# EasyEDA Pro project 差分采样.epro

# Schematic Schematic2
Board Name: 电流; Create Date: 2025-08-14; Page Name: P1; Project Name: 差分采样; Schematic Name: Schematic2; Update Date: 2025-08-14; BladeWidth: 10; Company: 嘉立创EDA; Page Size: A4; RegionStart: 1; ShowBorder: 1; TitleBlock: 1; TitleBlockPosition: 3; Version: V1.0; XRegionCount: 6; YRegionCount: 4
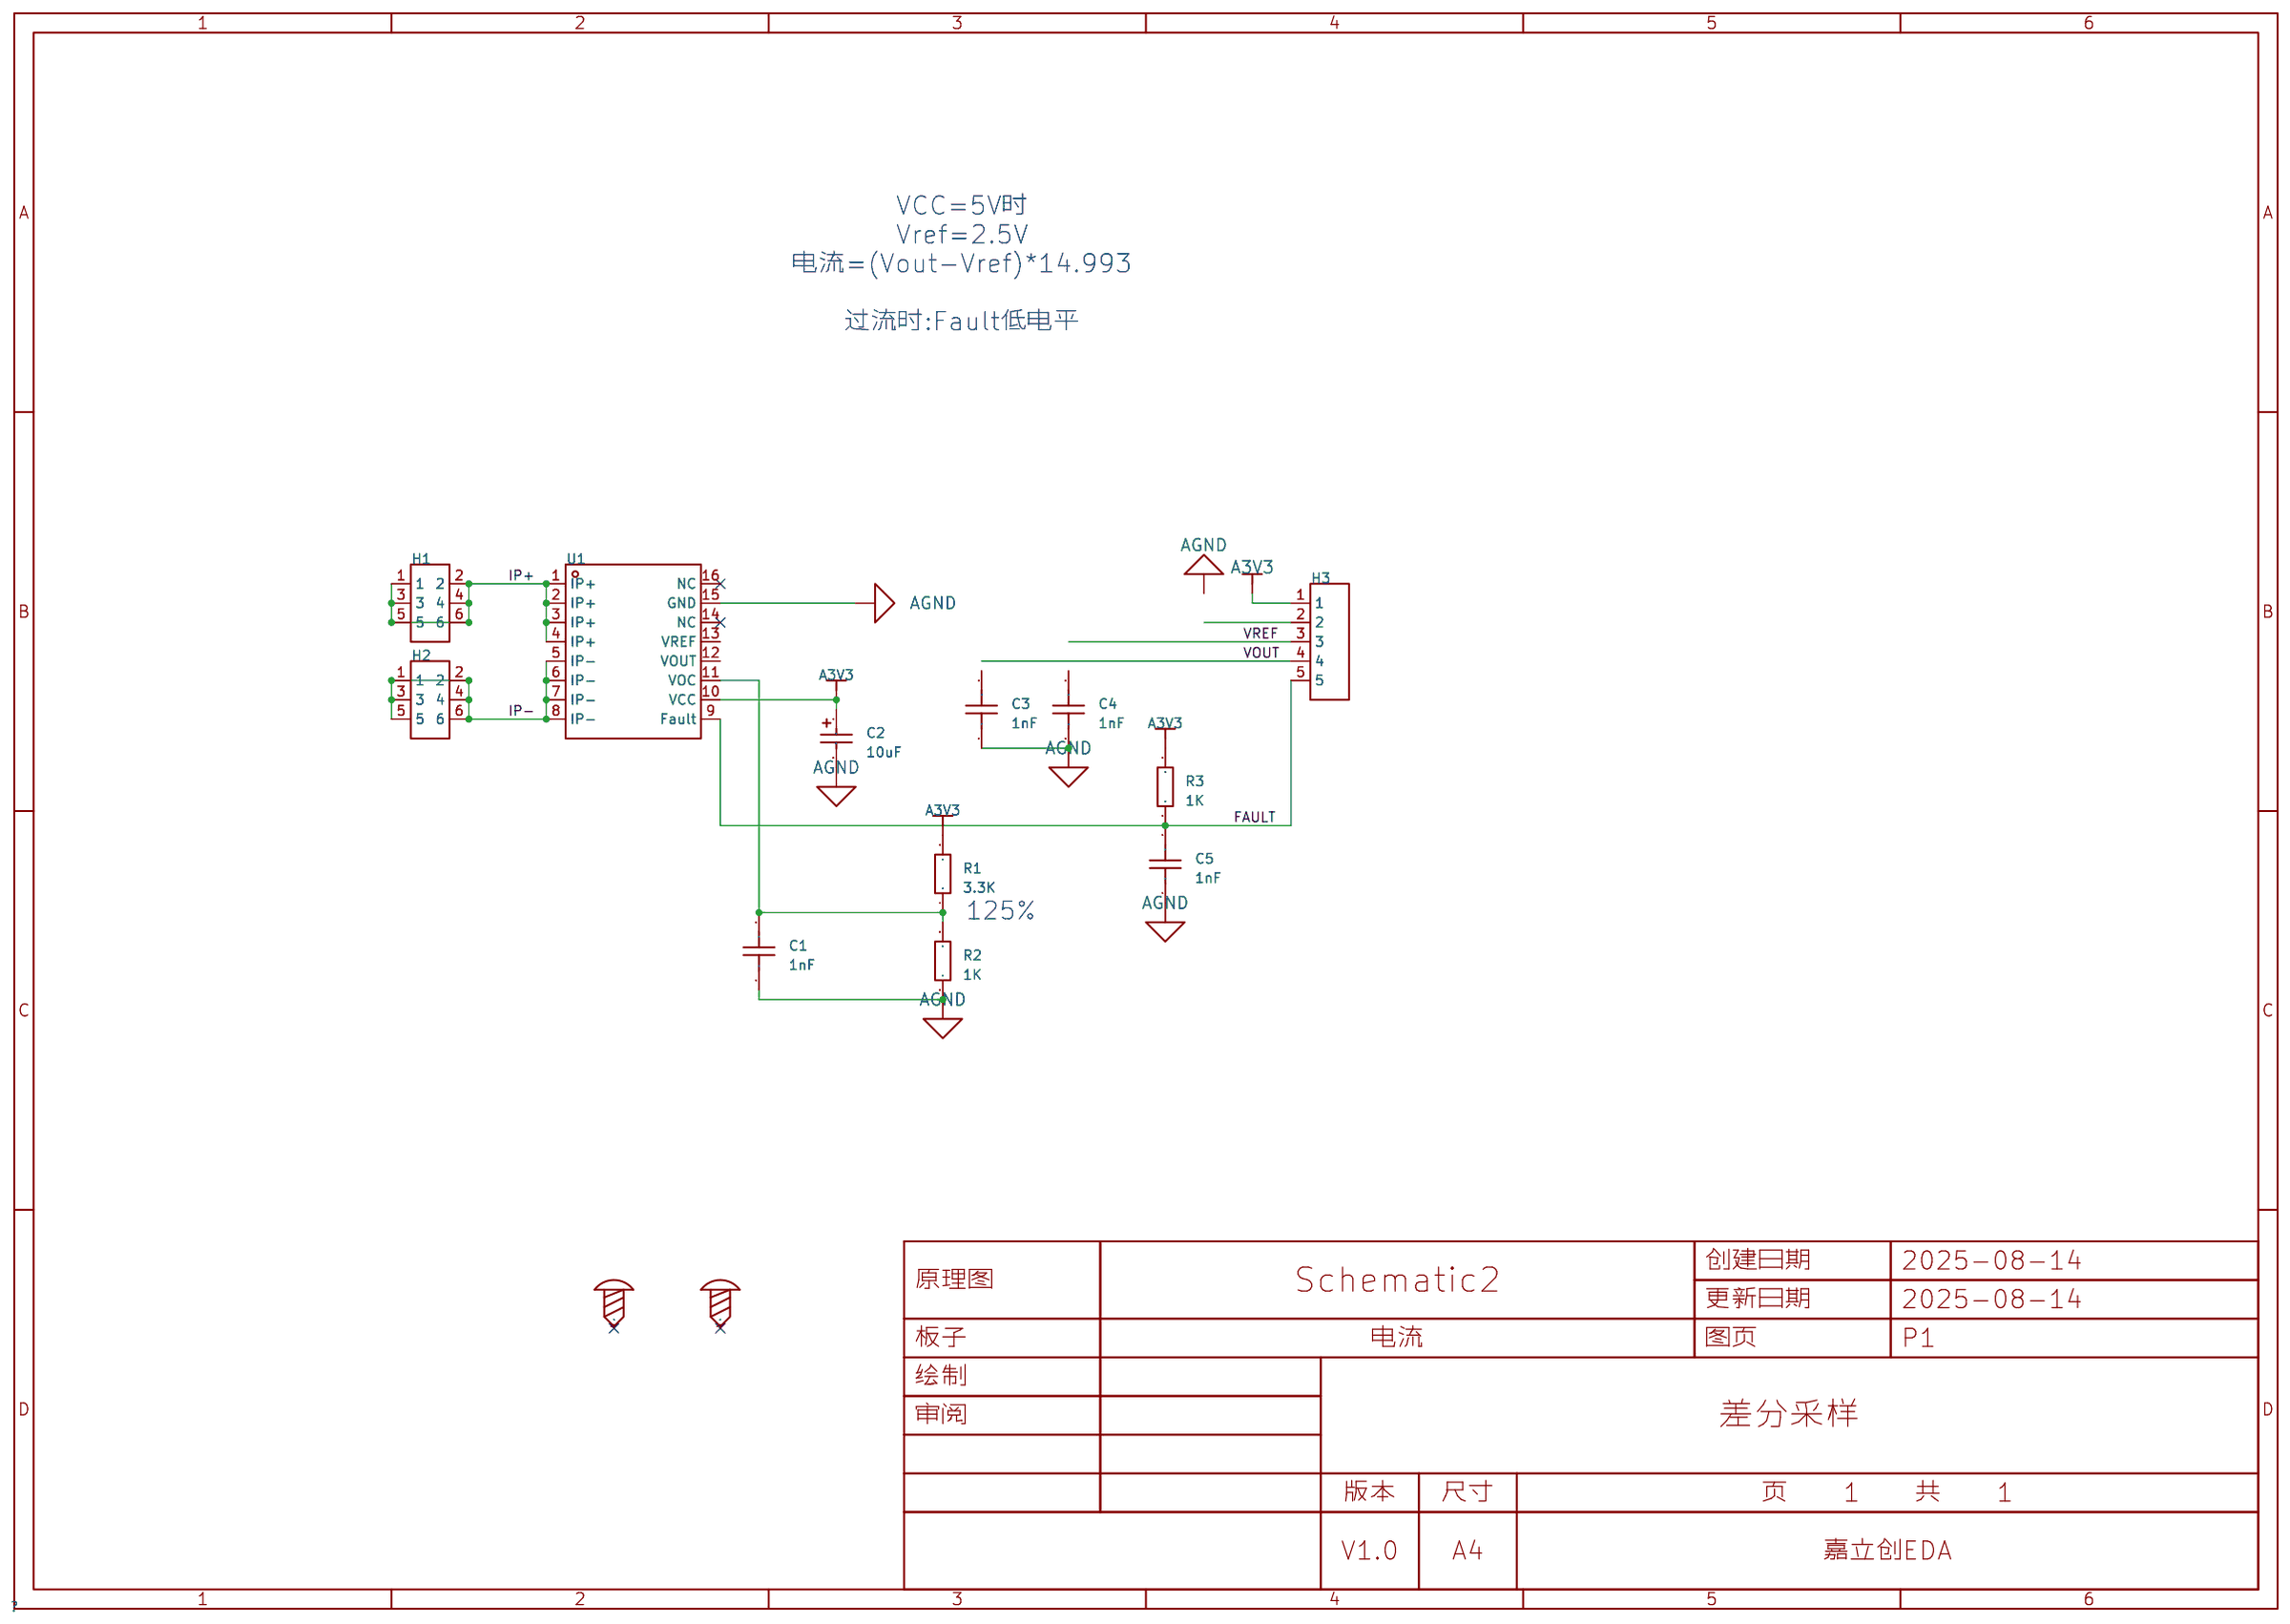
[diagram p0: schematic sheet]

## Parts
C1  1nF  [C0805]
C2  10uF  [CAP-SMD_L3.2-W1.6-RD-C7171]
C3  1nF  [C0805]
C4  1nF  [C0805]
C5  1nF  [C0805]
H1  PH2.54-07-03PWS  [HDR-TH_6P-P2.54-H-M-R2-C3-S2.54-W12.3-N]
H2  PH2.54-07-03PWS  [HDR-TH_6P-P2.54-H-M-R2-C3-S2.54-W12.3-N]
H3  PZ254R-11-05P  [HDR-TH_5P-P2.54-H-M-W10.4]
R1  3.3K  [R0805]
R2  1K  [R0805]
R3  1K  [R0805]
SCREW1  -  [M2螺丝]
SCREW2  -  [M2螺丝]
U1  -  [NSM2015(SOW16)]

## Library data of the parts
C1 C3-C5 = CAP_0805: Supplier Footprint: 0805
C2 = TAJA106K016RNJ: 容值:10uF;精度:±10%;额定电压:16V;等效串联电阻(ESR):3Ω@100kHz;; LCSC Part Name: 10uF ±10% 16V; Supplier Part: C7171; Manufacturer: Kyocera AVX; Supplier Footprint: CASE-A-3216-18(mm); JLCPCB Part Class: 基础库; Supplier: LCSC; Tolerance: ±10%; Voltage Rating: 16V; Equivalent Series Resistance(ESR): 3Ω@100kHz; Operating Temperature: -55℃~+125℃
H1 H2 = PH2.54-07-03PWS: 插针结构:2x3P;间距:2.54mm;圆针/方针:方针;安装方式:弯插;排数:双排;总PIN位数:6P;配合针长度:6mm;塑高:2.5mm;触头材质:黄铜;工作温度:-40℃~+105℃;颜色:黑色;; LCSC Part Name: 2x3P 间距:2.54mm 方针 弯插; Supplier Part: C7501617; Manufacturer: XUNPU(讯普); Supplier Footprint: 弯插,P=2.54mm; JLCPCB Part Class: Extended Part; Datasheet: https://atta.szlcsc.com/upload/public/pdf/source/20241122/C715A738E7C0FD419A695A197092155B.pdf; Supplier: LCSC; Pin Structure: 2x3P; Pitch: 2.54mm; Circluar Pins/Square Pins: 方针; Mounting Type: 弯插; Number of Rows: 双排; Number of Pins: 6P; Length of Mating Pin: 6mm; Insulation Height: 2.5mm; Contact Material: 黄铜; Operating Temperature: -40℃~+105℃; Color: 黑色
H3 = PZ254R-11-05P: 插针结构:1x5P;间距:2.54mm;行距:-;圆针/方针:方针;安装方式:弯插;排数:单排;总PIN位数:5P;额定电流:-;额定电压:-;配合针长度:6mm;塑高:2.5mm;触头材质:黄铜;触头镀层:-;工作温度:-40℃~+105℃;颜色:黑色;; LCSC Part Name: 1x5P 间距:2.54mm 方针 弯插; Supplier Part: C492413; Manufacturer: XFCN(兴飞); Supplier Footprint: 弯插,P=2.54mm; JLCPCB Part Class: 扩展库; Datasheet: https://atta.szlcsc.com/upload/public/pdf/source/20200309/C492413_82088D06BDD816AEC12FB986624DD327.pdf; Supplier: LCSC; Pin Structure: 1x5P; Pitch: 2.54mm; Circluar Pins/Square Pins: 方针; Mounting Type: 弯插; Number of Rows: 单排; Number of Pins: 5P; Length of Mating Pin: 6mm; Insulation Height: 2.5mm; Contact Material: 黄铜; Operating Temperature: -40℃~+105℃; Color: 黑色
R1-R3 = Res_0805: Supplier Footprint: 0805
SCREW1 SCREW2 = M2螺丝: Supplier Footprint: 插件
U1 = NSM2015: 霍尔电流传感器

## Nets
A3V3: C2.1 H3.1 R1.2 R3.2 U1.10(VCC)
AGND: C1.1 C2.2 C3.1 C4.1 C5.1 H3.2 R2.1 U1.15(GND)
FAULT: C5.2 H3.5 R3.1 U1.9(Fault)
IP+: H1.1 H1.2 H1.3 H1.4 H1.5 H1.6 U1.1(IP+) U1.2(IP+) U1.3(IP+) U1.4(IP+)
IP-: H2.1 H2.2 H2.3 H2.4 H2.5 H2.6 U1.5(IP-) U1.6(IP-) U1.7(IP-) U1.8(IP-)
VOUT: C3.2 H3.4 U1.12(VOUT)
VREF: C4.2 H3.3 U1.13(VREF)
$1N949: C1.2 R1.1 R2.2 U1.11(VOC)

Not connected (* = marked no-connect by the designer): SCREW1 1*; SCREW2 1*; U1 14(NC)* 16(NC)*

## Notes on the sheet
- VCC=5V时
  Vref=2.5V
  电流=(Vout-Vref)*14.993
  过流时:Fault低电平
- 125%

# Schematic Schematic1
Board Name: 电压; Create Date: 2025-07-23; Page Name: P1; Project Name: 差分采样; Schematic Name: Schematic1; Update Date: 2025-09-04; BladeWidth: 10; Company: 嘉立创EDA; Page Size: A4; RegionStart: 1; ShowBorder: 1; TitleBlock: 1; TitleBlockPosition: 3; Version: V1.0; XRegionCount: 6; YRegionCount: 4
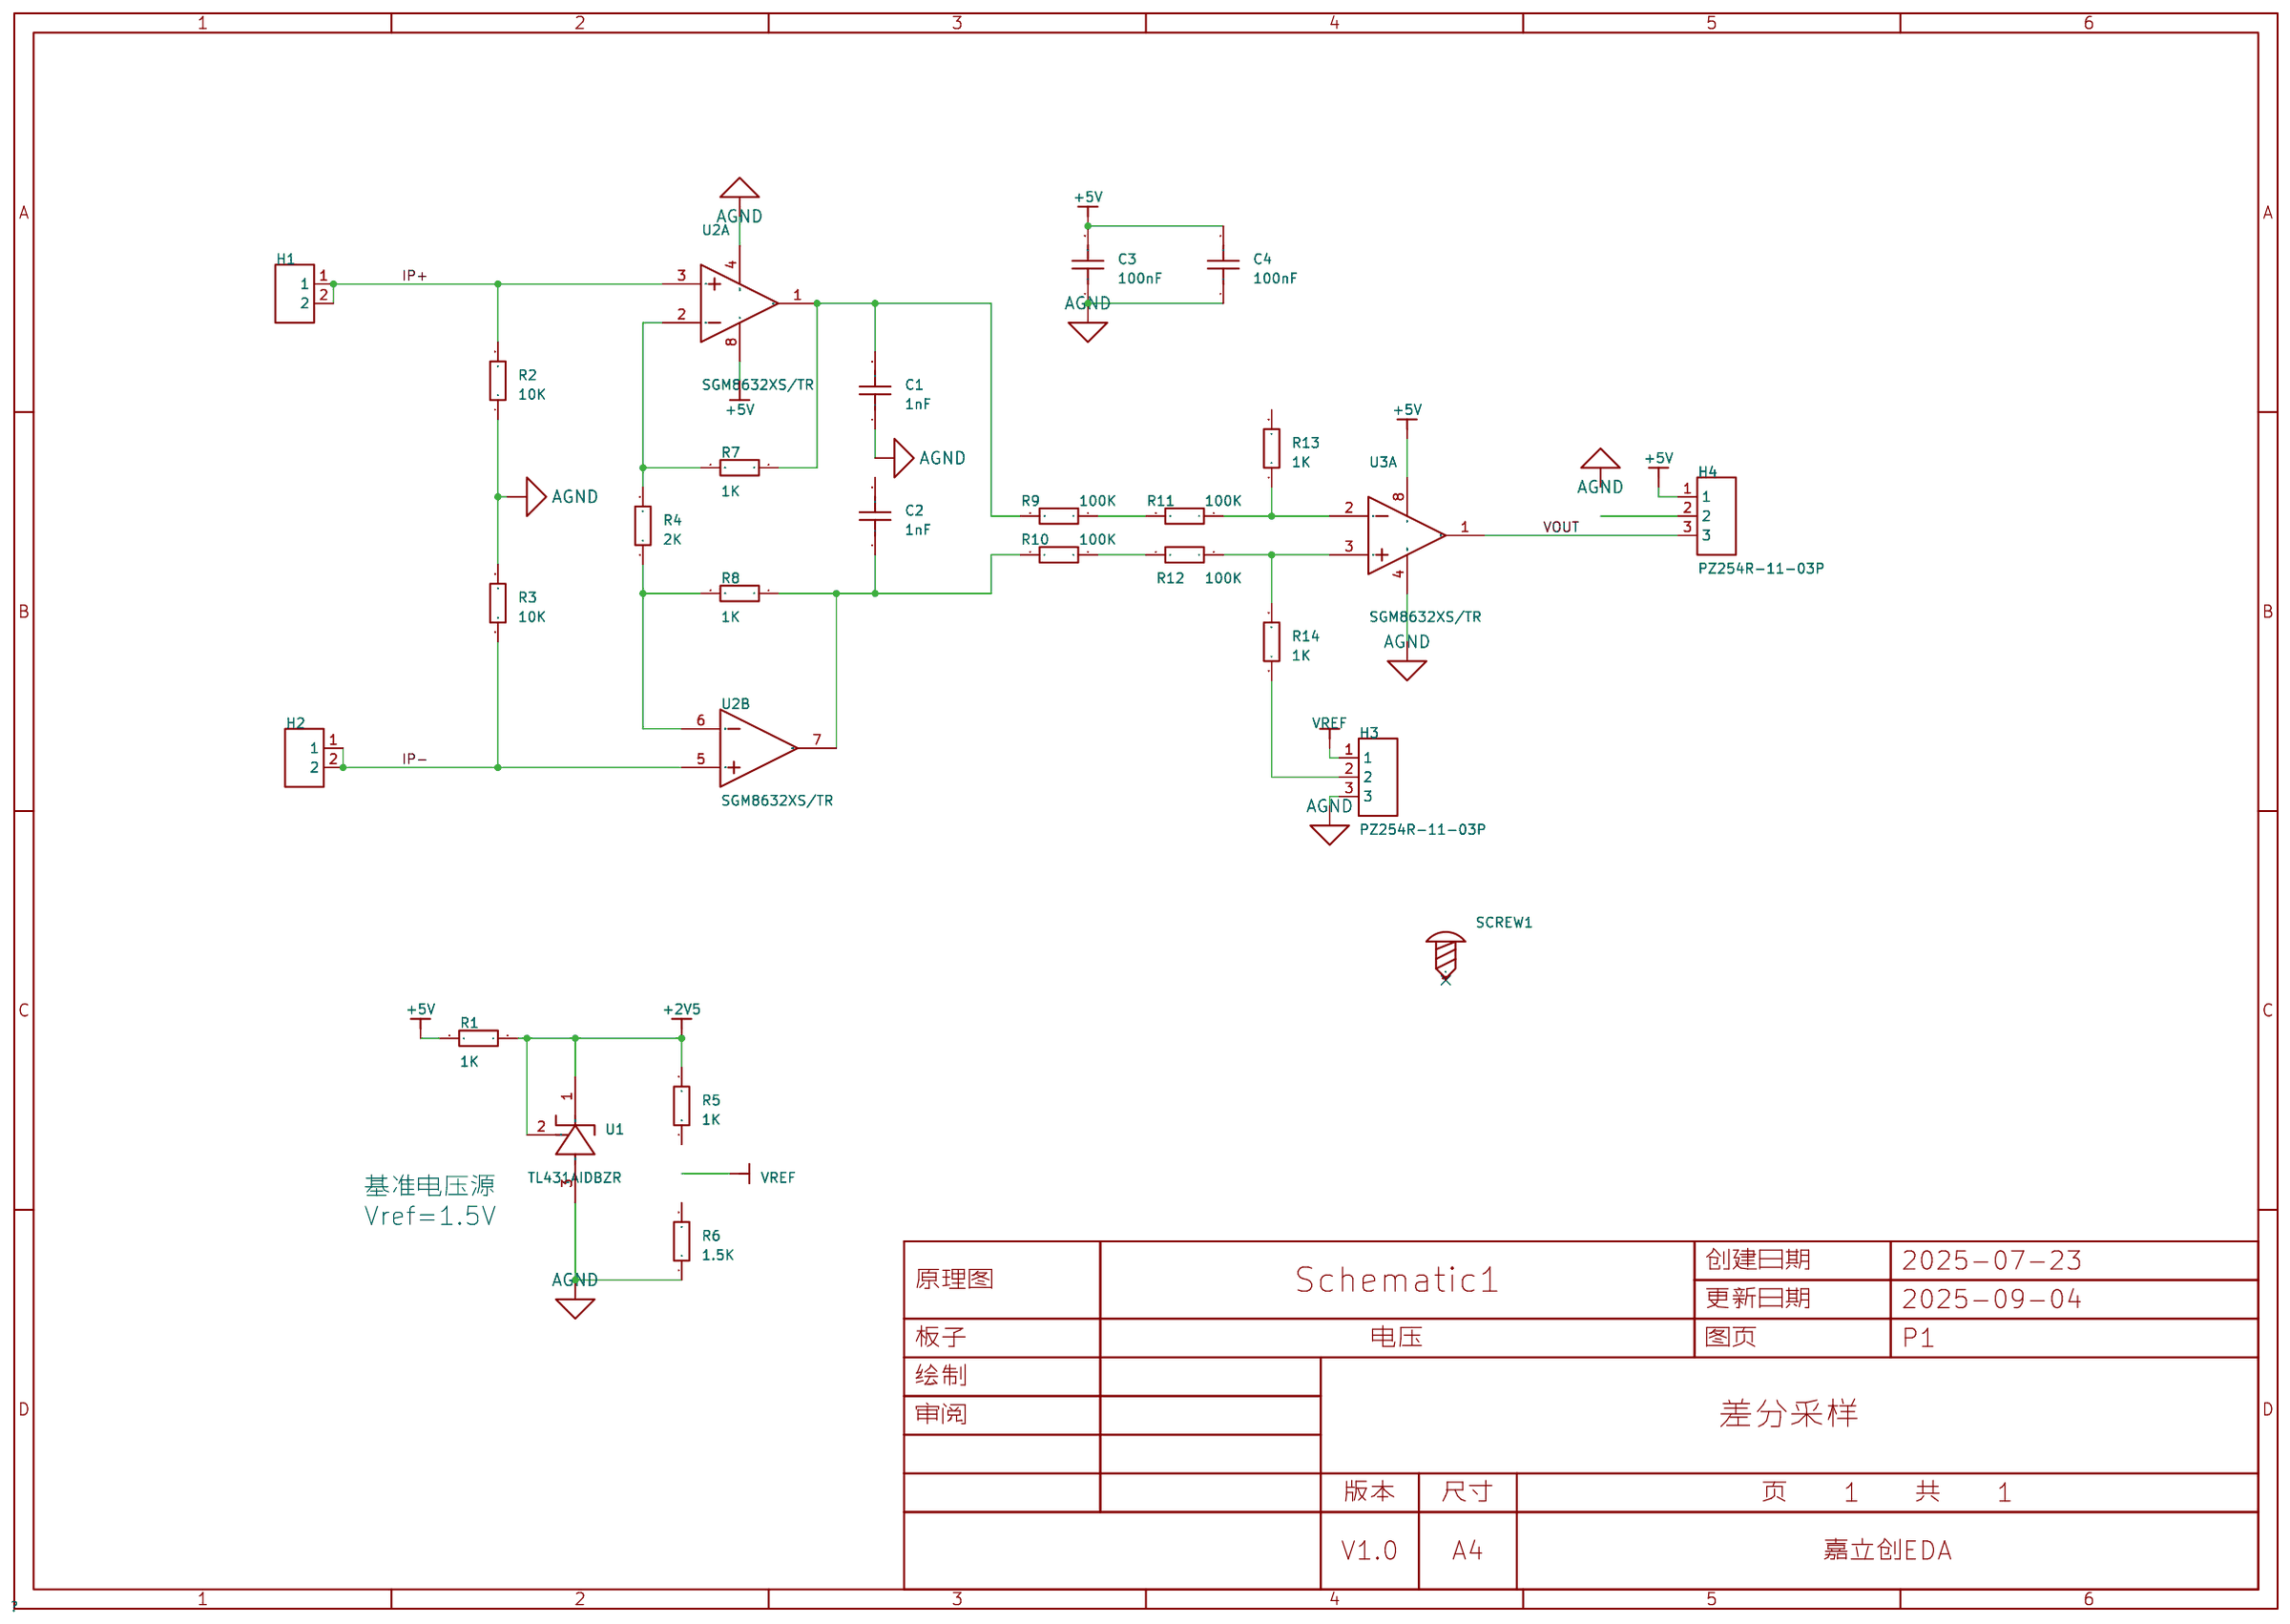
[diagram p1: schematic sheet]

## Parts
C1  1nF  [C0805]
C2  1nF  [C0805]
C3  100nF  [C0805]
C4  100nF  [C0805]
H1  PZ254R-11-02P  [HDR-TH_2P-P2.54-H-M-W10.4]
H2  PZ254R-11-02P  [HDR-TH_2P-P2.54-H-M-W10.4]
H3  PZ254R-11-03P  [HDR-TH_3P-P2.54-H-M-W10.4]
H4  PZ254R-11-03P  [HDR-TH_3P-P2.54-H-M-W10.4]
R1  1K  [R0805]
R2  10K  [R0805]
R3  10K  [R0805]
R4  2K  [R0805]
R5  1K  [R0805]
R6  1.5K  [R0805]
R7  1K  [R0805]
R8  1K  [R0805]
R9  100K  [R0805]
R10  100K  [R0805]
R11  100K  [R0805]
R12  100K  [R0805]
R13  1K  [R0805]
R14  1K  [R0805]
SCREW1  -  [M2螺丝]
U1  TL431AIDBZR  [SOT-23-3_L2.9-W1.6-P1.90-LS2.8-BR]
U2  SGM8632XS/TR  [SOIC-8_L4.9-W3.9-P1.27-LS6.0-BL]  (sections 1,2)
U3  SGM8632XS/TR  [SOIC-8_L4.9-W3.9-P1.27-LS6.0-BL]  (section 1)

## Library data of the parts
C1-C4 = CAP_0805: Supplier Footprint: 0805
H1 H2 = PZ254R-11-02P: 插针结构:1x2P;间距:2.54mm;行距:-;圆针/方针:方针;安装方式:弯插;排数:单排;总PIN位数:2P;额定电流:-;额定电压:-;配合针长度:6mm;塑高:2.5mm;触头材质:黄铜;触头镀层:-;工作温度:-40℃~+105℃;颜色:黑色;; LCSC Part Name: 1x2P 间距:2.54mm 方针 弯插; Supplier Part: C492410; Manufacturer: XFCN(兴飞); Supplier Footprint: 弯插,P=2.54mm; JLCPCB Part Class: 扩展库; Datasheet: https://atta.szlcsc.com/upload/public/pdf/source/20200309/C492410_AD20A982E51A4870F6FD4D2413672598.pdf; Supplier: LCSC; Pin Structure: 1x2P; Pitch: 2.54mm; Circluar Pins/Square Pins: 方针; Mounting Type: 弯插; Number of Rows: 单排; Number of Pins: 2P; Length of Mating Pin: 6mm; Insulation Height: 2.5mm; Contact Material: 黄铜; Operating Temperature: -40℃~+105℃; Color: 黑色
H3 H4 = PZ254R-11-03P: 插针结构:1x3P;间距:2.54mm;行距:-;圆针/方针:方针;安装方式:弯插;排数:单排;总PIN位数:3P;额定电流:-;额定电压:-;配合针长度:6mm;塑高:2.5mm;触头材质:黄铜;触头镀层:-;工作温度:-40℃~+105℃;颜色:黑色;; LCSC Part Name: 1x3P 间距:2.54mm 方针 弯插; Supplier Part: C492411; Manufacturer: XFCN(兴飞); Supplier Footprint: 弯插,P=2.54mm; JLCPCB Part Class: 扩展库; Datasheet: https://atta.szlcsc.com/upload/public/pdf/source/20200309/C492411_5256E8AAA7569F6D33B6ADBFAE4F2888.pdf; Supplier: LCSC; Pin Structure: 1x3P; Pitch: 2.54mm; Circluar Pins/Square Pins: 方针; Mounting Type: 弯插; Number of Rows: 单排; Number of Pins: 3P; Length of Mating Pin: 6mm; Insulation Height: 2.5mm; Contact Material: 黄铜; Operating Temperature: -40℃~+105℃; Color: 黑色
R1-R14 = Res_0805: Supplier Footprint: 0805
SCREW1 = M2螺丝: Supplier Footprint: 插件
U1 = TL431AIDBZR: 输出类型:可调;输入电压:-;输出电压:2.495V~36V;输出电流:100mA;精度:±1%;; Supplier Part: C23892; Manufacturer: TI(德州仪器); Supplier Footprint: SOT-23; JLCPCB Part Class: 扩展库; Datasheet: https://www.ti.com/cn/lit/gpn/tl431; Supplier: LCSC; Output Type: 可调; Output Voltage: 2.495V~36V; Output Current: 100mA; Tolerance: ±1%; Reference Type: 并联; Minimum Cathode Current for Regulation: 700uA; Operating Temperature: -40℃~+85℃@(Ta)
U2 U3 = SGM8632XS/TR: 放大器数:双路;轨到轨:-;增益带宽积(GBP):-;输入失调电压(Vos):3.5mV;压摆率(SR):3.7V/us;输入偏置电流(Ib):1pA;; Supplier Part: C68547; Manufacturer: SGMICRO(圣邦微); Supplier Footprint: SOIC-8; JLCPCB Part Class: Extended Part; Datasheet: https://atta.szlcsc.com/upload/public/pdf/source/20170908/C68547_1504870087116958032.pdf; Supplier: LCSC; Number of Channels: 双路; Maximum Power Supply Range (Vdd-Vss): 5.5V; Vos - Input Offset Voltage: 3.5mV; Input Offset Voltage Drift(Vos TC): 2.4uV/℃; Slew Rate: 3.7V/us; Ib - Input Bias Current: 1pA; Noise density(eN): 13nV/√Hz@1kHz; Common Mode Rejection Ratio(CMRR): 86dB; Operating Temperature: -40℃~+125℃; Single supply: 2V~5.5V

## Nets
+2V5: R1.1 R5.2 U1.1(CATHODE) U1.2(REF)
+5V: C3.2 C4.2 H4.1 R1.2 U2.8(VCC+) U3.8(VCC+)
AGND: C1.1 C2.2 C3.1 C4.1 H3.3 H4.2 R2.1 R3.2 R6.1 U1.3(ANODE) U2.4(VCC-/GND) U3.4(VCC-/GND)
IP+: H1.1 H1.2 R2.2 U2.3(IN1+)
IP-: H2.1 H2.2 R3.1 U2.5(IN2+)
VOUT: H4.3 R13.2 U3.1(OUT1)
VREF: H3.1 R5.1 R6.2
$1N1802: R4.1 R8.2 U2.6(IN2-)
$1N1807: R4.2 R7.2 U2.2(IN1-)
$1N1968: R11.1 R13.1 U3.2(IN1-)
$1N1973: R12.1 R14.2 U3.3(IN1+)
$1N3429: H3.2 R14.1
$1N4502: R9.1 R11.2
$1N4511: C1.2 R7.1 R9.2 U2.1(OUT1)
$1N4538: R10.1 R12.2
$1N4547: C2.1 R8.1 R10.2 U2.7(OUT2)

Not connected (* = marked no-connect by the designer): SCREW1 1*

## Notes on the sheet
- 基准电压源
  Vref=1.5V

# Schematic Schematic3
Board Name: Board1; Create Date: 2025-09-16; Page Name: P1; Project Name: 差分采样; Schematic Name: Schematic3; Update Date: 2025-09-16; BladeWidth: 10; Company: 嘉立创EDA; Page Size: A4; RegionStart: 1; ShowBorder: 1; TitleBlock: 1; TitleBlockPosition: 3; Version: V1.0; XRegionCount: 6; YRegionCount: 4
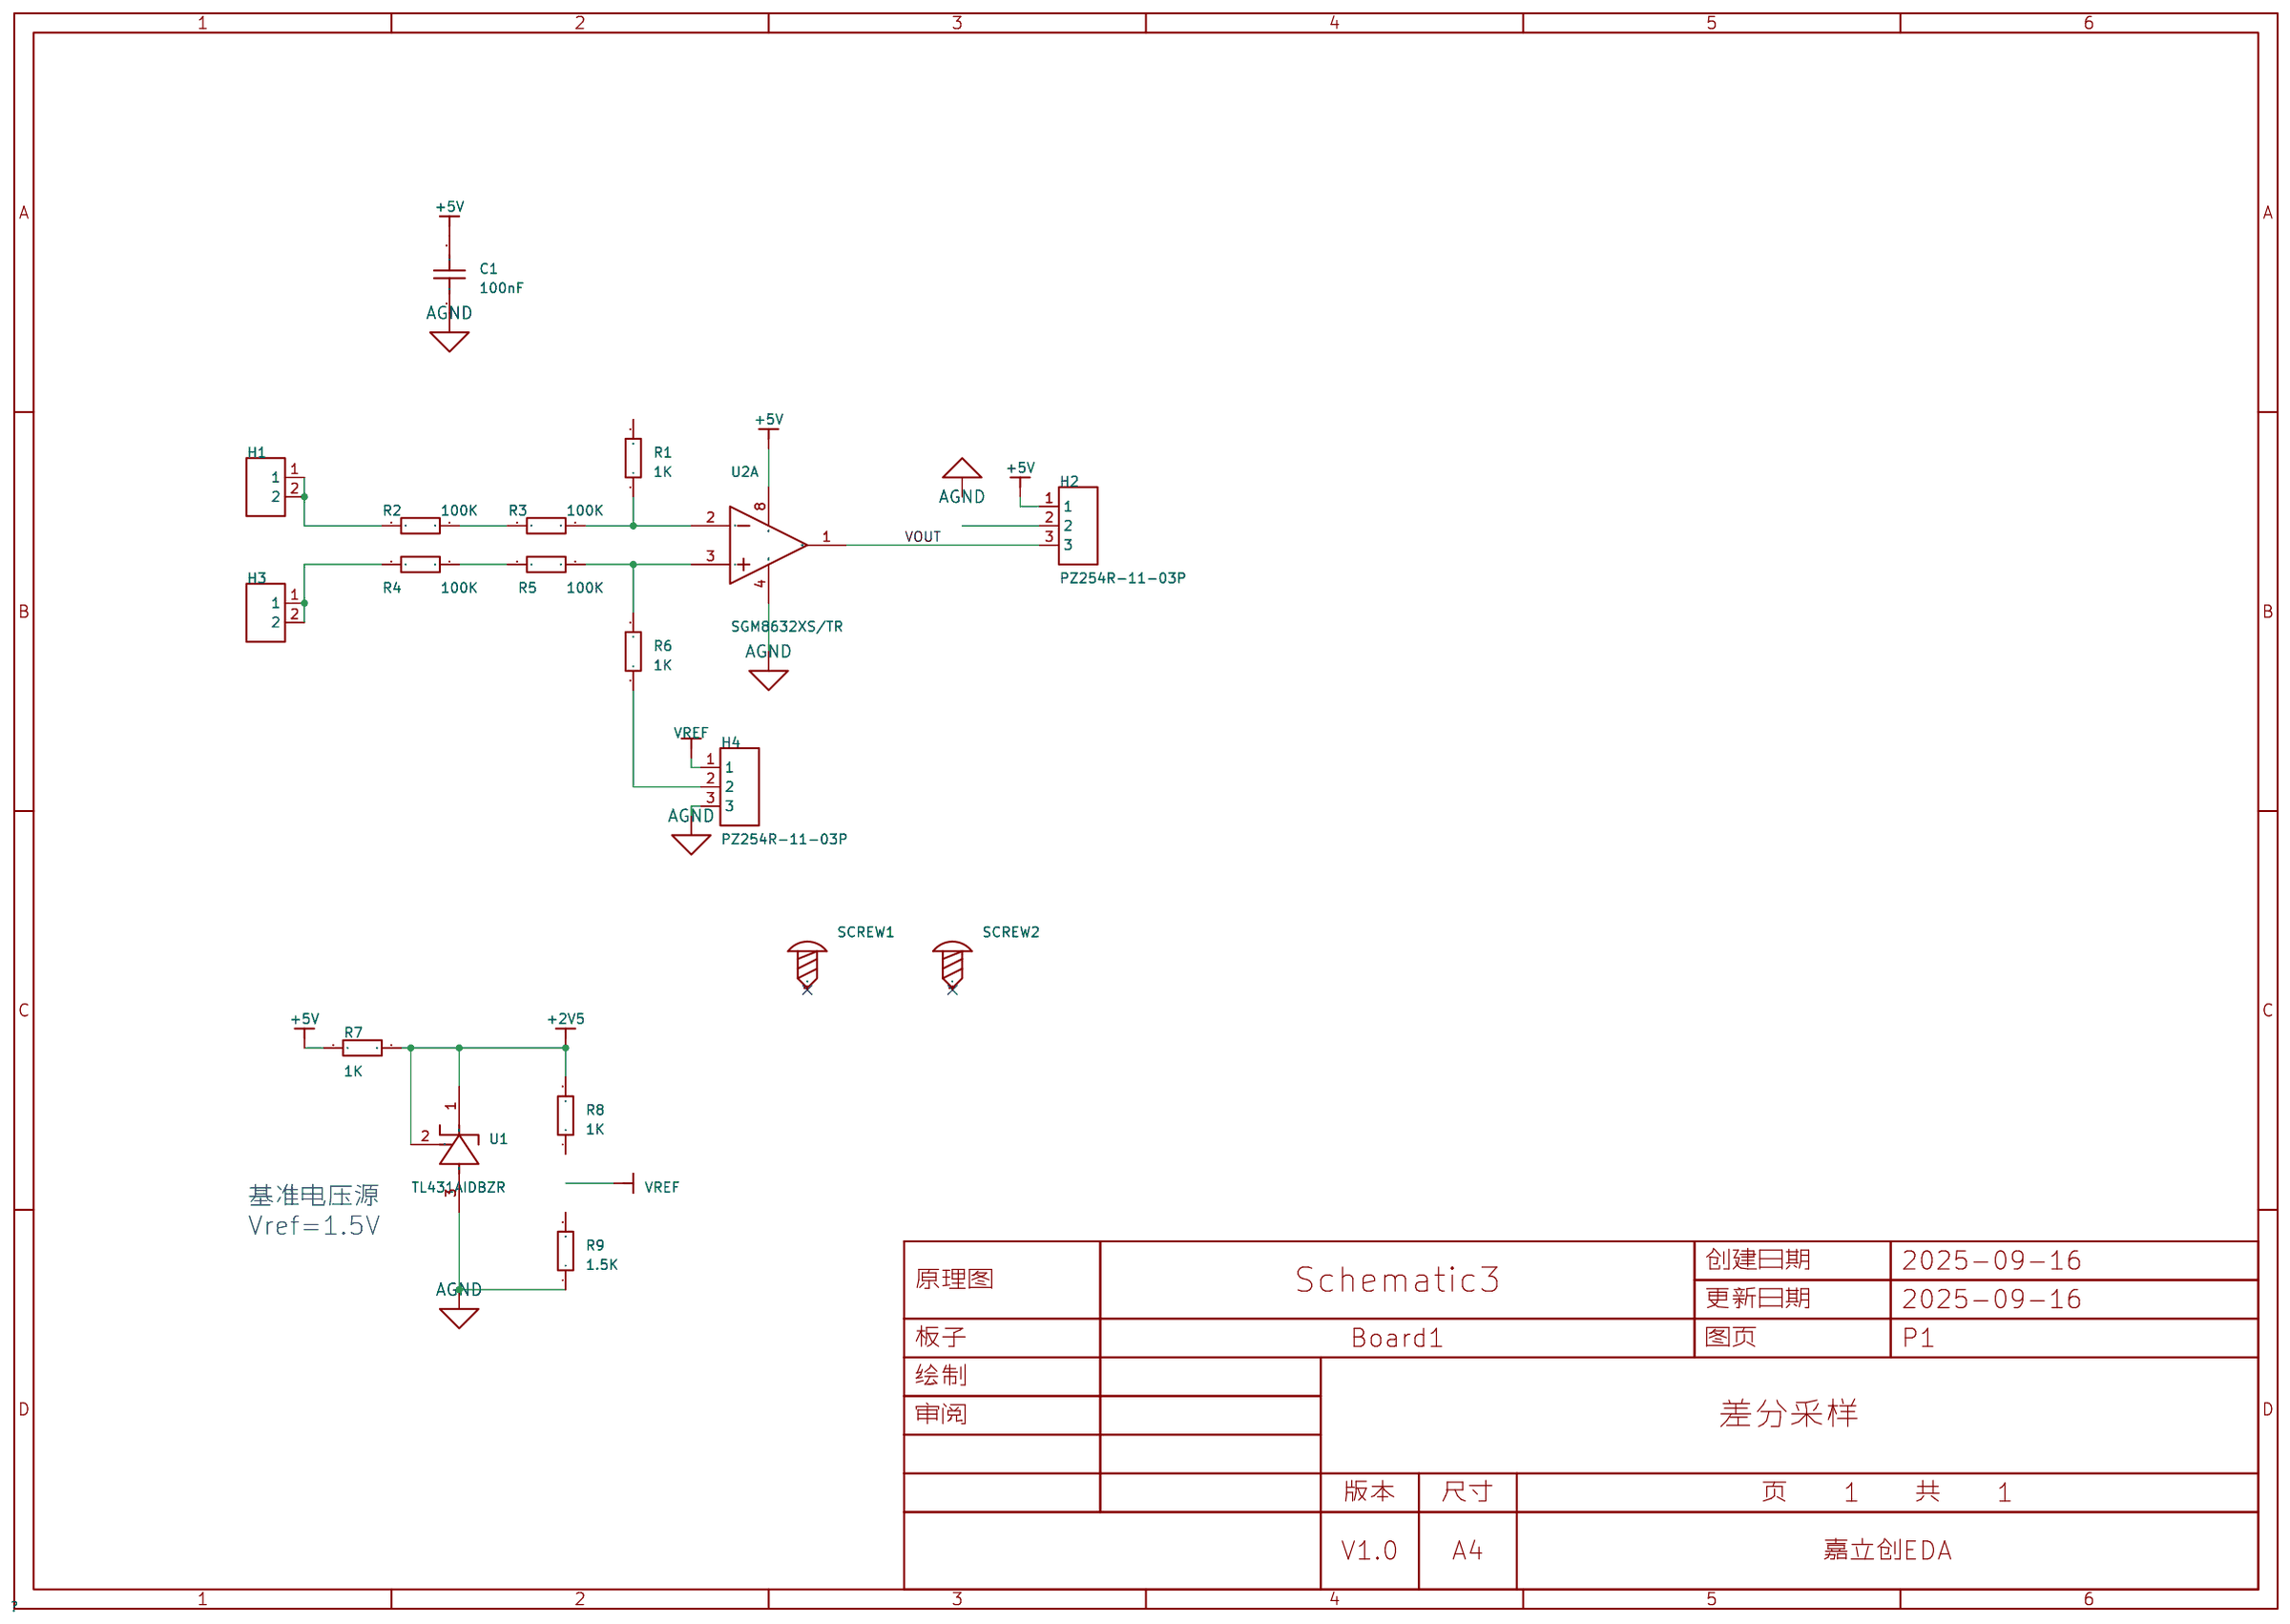
[diagram p2: schematic sheet]

## Parts
C1  100nF  [C0805]
H1  PZ254R-11-02P  [HDR-TH_2P-P2.54-H-M-W10.4]
H2  PZ254R-11-03P  [HDR-TH_3P-P2.54-H-M-W10.4]
H3  PZ254R-11-02P  [HDR-TH_2P-P2.54-H-M-W10.4]
H4  PZ254R-11-03P  [HDR-TH_3P-P2.54-H-M-W10.4]
R1  1K  [R0805]
R2  100K  [R0805]
R3  100K  [R0805]
R4  100K  [R0805]
R5  100K  [R0805]
R6  1K  [R0805]
R7  1K  [R0805]
R8  1K  [R0805]
R9  1.5K  [R0805]
SCREW1  -  [M2螺丝]
SCREW2  -  [M2螺丝]
U1  TL431AIDBZR  [SOT-23-3_L2.9-W1.6-P1.90-LS2.8-BR]
U2  SGM8632XS/TR  [SOIC-8_L4.9-W3.9-P1.27-LS6.0-BL]  (section 1)

## Library data of the parts
C1 = CAP_0805: Supplier Footprint: 0805
H1 H3 = PZ254R-11-02P: 插针结构:1x2P;间距:2.54mm;行距:-;圆针/方针:方针;安装方式:弯插;排数:单排;总PIN位数:2P;额定电流:-;额定电压:-;配合针长度:6mm;塑高:2.5mm;触头材质:黄铜;触头镀层:-;工作温度:-40℃~+105℃;颜色:黑色;; LCSC Part Name: 1x2P 间距:2.54mm 方针 弯插; Supplier Part: C492410; Manufacturer: XFCN(兴飞); Supplier Footprint: 弯插,P=2.54mm; JLCPCB Part Class: 扩展库; Datasheet: https://atta.szlcsc.com/upload/public/pdf/source/20200309/C492410_AD20A982E51A4870F6FD4D2413672598.pdf; Supplier: LCSC; Pin Structure: 1x2P; Pitch: 2.54mm; Circluar Pins/Square Pins: 方针; Mounting Type: 弯插; Number of Rows: 单排; Number of Pins: 2P; Length of Mating Pin: 6mm; Insulation Height: 2.5mm; Contact Material: 黄铜; Operating Temperature: -40℃~+105℃; Color: 黑色
H2 H4 = PZ254R-11-03P: 插针结构:1x3P;间距:2.54mm;行距:-;圆针/方针:方针;安装方式:弯插;排数:单排;总PIN位数:3P;额定电流:-;额定电压:-;配合针长度:6mm;塑高:2.5mm;触头材质:黄铜;触头镀层:-;工作温度:-40℃~+105℃;颜色:黑色;; LCSC Part Name: 1x3P 间距:2.54mm 方针 弯插; Supplier Part: C492411; Manufacturer: XFCN(兴飞); Supplier Footprint: 弯插,P=2.54mm; JLCPCB Part Class: 扩展库; Datasheet: https://atta.szlcsc.com/upload/public/pdf/source/20200309/C492411_5256E8AAA7569F6D33B6ADBFAE4F2888.pdf; Supplier: LCSC; Pin Structure: 1x3P; Pitch: 2.54mm; Circluar Pins/Square Pins: 方针; Mounting Type: 弯插; Number of Rows: 单排; Number of Pins: 3P; Length of Mating Pin: 6mm; Insulation Height: 2.5mm; Contact Material: 黄铜; Operating Temperature: -40℃~+105℃; Color: 黑色
R1-R9 = Res_0805: Supplier Footprint: 0805
SCREW1 SCREW2 = M2螺丝: Supplier Footprint: 插件
U1 = TL431AIDBZR: 输出类型:可调;输入电压:-;输出电压:2.495V~36V;输出电流:100mA;精度:±1%;; Supplier Part: C23892; Manufacturer: TI(德州仪器); Supplier Footprint: SOT-23; JLCPCB Part Class: 扩展库; Datasheet: https://www.ti.com/cn/lit/gpn/tl431; Supplier: LCSC; Output Type: 可调; Output Voltage: 2.495V~36V; Output Current: 100mA; Tolerance: ±1%; Reference Type: 并联; Minimum Cathode Current for Regulation: 700uA; Operating Temperature: -40℃~+85℃@(Ta)
U2 = SGM8632XS/TR: 放大器数:双路;轨到轨:-;增益带宽积(GBP):-;输入失调电压(Vos):3.5mV;压摆率(SR):3.7V/us;输入偏置电流(Ib):1pA;; Supplier Part: C68547; Manufacturer: SGMICRO(圣邦微); Supplier Footprint: SOIC-8; JLCPCB Part Class: Extended Part; Datasheet: https://atta.szlcsc.com/upload/public/pdf/source/20170908/C68547_1504870087116958032.pdf; Supplier: LCSC; Number of Channels: 双路; Maximum Power Supply Range (Vdd-Vss): 5.5V; Vos - Input Offset Voltage: 3.5mV; Input Offset Voltage Drift(Vos TC): 2.4uV/℃; Slew Rate: 3.7V/us; Ib - Input Bias Current: 1pA; Noise density(eN): 13nV/√Hz@1kHz; Common Mode Rejection Ratio(CMRR): 86dB; Operating Temperature: -40℃~+125℃; Single supply: 2V~5.5V

## Nets
+2V5: R7.1 R8.2 U1.1(CATHODE) U1.2(REF)
+5V: C1.2 H2.1 R7.2 U2.8(VCC+)
AGND: C1.1 H2.2 H4.3 R9.1 U1.3(ANODE) U2.4(VCC-/GND)
VOUT: H2.3 R1.2 U2.1(OUT1)
VREF: H4.1 R8.1 R9.2
$1N698: R5.1 R6.2 U2.3(IN1+)
$1N699: R4.1 R5.2
$1N700: R2.1 R3.2
$1N701: R1.1 R3.1 U2.2(IN1-)
$1N710: H4.2 R6.1
$1N927: H1.1 H1.2 R2.2
$1N934: H3.1 H3.2 R4.2

Not connected (* = marked no-connect by the designer): SCREW1 1*; SCREW2 1*

## Notes on the sheet
- 基准电压源
  Vref=1.5V

# Board PCB
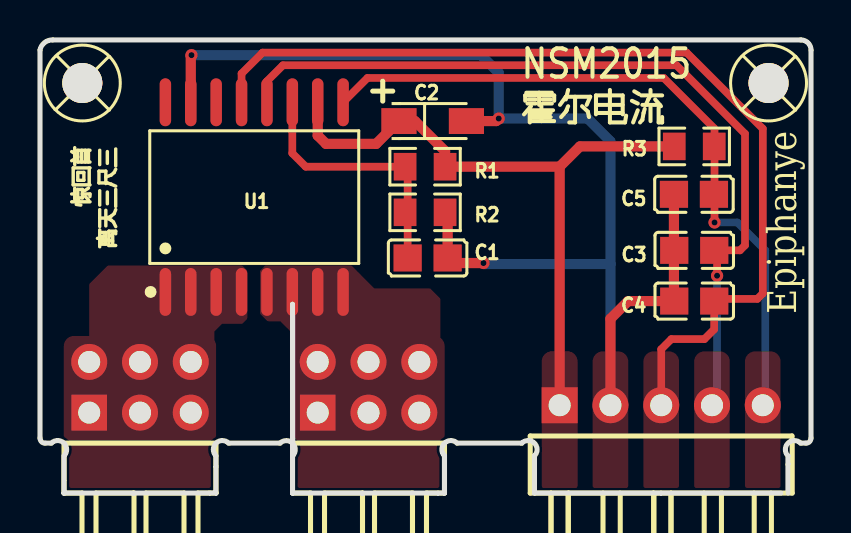
[diagram p3: board, top side]
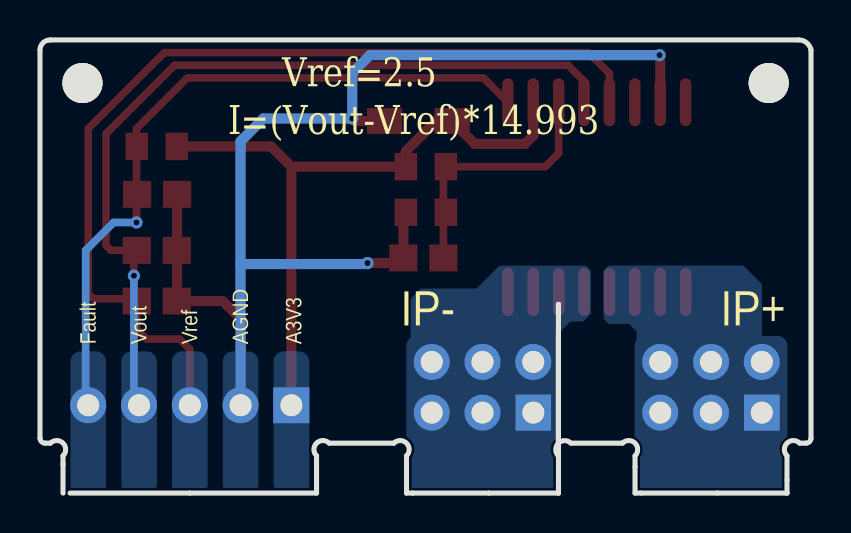
[diagram p4: board, bottom side, seen from below]

Outline 38.57 x 22.7 mm; copper layers: Top Layer, Bottom Layer. Coordinates in mm from the lower left corner of the outline.
Outline path: 37.06,0 24.73,0 24.73,1.86 arc(24.73,2.5) 24.1,2.5 20.87,2.5 arc(20.23,2.5) 20.23,1.86 20.23,0 12.63,0 12.63,0 12.63,9.46 12.64,1.87 arc(12.64,2.5) 12.01,2.5 9.44,2.5 arc(8.8,2.5) 8.8,1.86 8.8,0 1.2,0 1.2,0 1.2,1.86 arc(1.2,2.5) 0.57,2.5 0.25,2.5 arc(0.07,2.57) 0,2.75 0,22.19 arc(0.22,22.56) 0.64,22.7 38.06,22.7 arc(38.42,22.55) 38.57,22.19 38.57,2.75 arc(38.49,2.57) 38.31,2.5 38.05,2.5 arc(37.41,2.5) 37.41,1.86 37.41,0
Stack: Top Layer 0.035mm / Dielectric1 1.51mm FR4 er 4.5 / Bottom Layer 0.035mm

## Design rules (mm)
net AGND: PWR
net A3V3: PWR
spacing copperThickness1oz (default): track to track 0.102, other pairs 0.152 to 0.3
spacing copperThickness2oz: track to track 0.203, other pairs 0.152 to 0.3
spacing Plane_innerPlane: track to track 0.102, other pairs 0.152 to 0.3
spacing Copper_copperRegion: track to track 0.102, other pairs 0.152 to 0.3
track width copperThickness1oz (default): min 0.127, default 0.381, max 2.54
track width copperThickness2oz: min 0.203, default 0.254, max 2.54
track width PWR: min 0.127, default 0.508, max 2.54
differential pair differentialPair (default): width min 0.127, default 0.254, max 2.54; gap min 0.152, default 0.152
net class PWR uses PWR
net AGND uses PWR
net A3V3 uses PWR
pour e111 uses Copper_copperRegion
pour e113 uses Copper_copperRegion
pour e115 uses Copper_copperRegion
pour e117 uses Copper_copperRegion
pour e119 uses Copper_copperRegion
pour e121 uses Copper_copperRegion
pour e123 uses Copper_copperRegion
pour e125 uses Copper_copperRegion
pour e127 uses Copper_copperRegion
pour e129 uses Copper_copperRegion
pour e131 uses Copper_copperRegion
pour e133 uses Copper_copperRegion
pour e135 uses Copper_copperRegion
pour e137 uses Copper_copperRegion
pour e139 uses Copper_copperRegion
pour e141 uses Copper_copperRegion
pour e143 uses Copper_copperRegion
pour e145 uses Copper_copperRegion
pour e147 uses Copper_copperRegion
pour e149 uses Copper_copperRegion
pour e151 uses Copper_copperRegion

## Placement (name value [footprint] x y rotation side)
C1  1nF  [C0805]  19.39 11.78 180 top
C2  10uF  [CAP-SMD_L3.2-W1.6-RD-C7171]  19.64 18.64 0 top
C3  1nF  [C0805]  32.72 12.16 0 top
C4  1nF  [C0805]  32.72 9.62 0 top
C5  1nF  [C0805]  32.71 14.97 0 top
H1  PH2.54-07-03PWS  [HDR-TH_6P-P2.54-H-M-R2-C3-S2.54-W12.3-N]  5 5.3 0 top
H2  PH2.54-07-03PWS  [HDR-TH_6P-P2.54-H-M-R2-C3-S2.54-W12.3-N]  16.43 5.3 0 top
H3  PZ254R-11-05P  [HDR-TH_5P-P2.54-H-M-W10.4]  31.07 4.4 0 top
R1  3.3K  [R0805]  19.26 16.35 0 top
R2  1K  [R0805]  19.26 14.06 180 top
R3  1K  [R0805]  32.72 17.36 180 top
SCREW1  -  [M2螺丝]  2.12 20.54 0 top
SCREW2  -  [M2螺丝]  36.44 20.54 0 top
U1  -  [NSM2015(SOW16)]  10.63 14.83 0 top

## Footprints (pads in the part's own frame, mm; a bottom-side part is the same pattern mirrored in y, then rotated)
C0805
  rect 1.41x1.35 smd: 1(-1,0) 2(1,0)
CAP-SMD_L3.2-W1.6-RD-C7171
  rect 1.758x1.296 smd: 1(-1.687,0) 2(1.687,0)
HDR-TH_5P-P2.54-H-M-W10.4
  rect 1.8x1.8 hole 1.1: 1(-5.08,0)
  round 1.8 hole 1.1: 2(-2.54,0) 3(0,0) 4(2.54,0) 5(5.08,0)
HDR-TH_6P-P2.54-H-M-R2-C3-S2.54-W12.3-N
  rect 1.778x1.8 hole 1.1: 1(-2.54,-1.27)
  round 1.8 hole 1.1: 2(-2.54,1.27) 3(0,-1.27) 4(0,1.27) 5(2.54,-1.27) 6(2.54,1.27)
M2螺丝
  round 2 hole 2: 1(0,0)
NSM2015(SOW16)
  oval 0.574x2.401 smd: 1(-4.354,-4.75) 2(-3.084,-4.75) 3(-1.814,-4.75) 4(-0.544,-4.75) 5(0.726,-4.75) 6(1.996,-4.75) 7(3.266,-4.75) 8(4.536,-4.75) 9(4.536,4.75) 10(3.266,4.75) 11(1.996,4.75) 12(0.726,4.75) 13(-0.544,4.75) 14(-1.814,4.75) 15(-3.084,4.75) 16(-4.354,4.75)
R0805
  rect 1.133x1.377 smd: 1(-1,0) 2(1,0)

## Nets
As in the schematic.

Pads without a net: SCREW1 1; SCREW2 1; U1 14 16

## Via types
v1: diameter 0.61, hole 0.305, Top Layer to Bottom Layer, 5 vias

## Routing (per net, layer and track width the routed paths; a pad name or vN(x,y) marks a point on that pad's centre or on a via; arc(x,y) is an arc through that point)
A3V3: length 33.9
  Top Layer w0.508: U1.10 13.89,17.91 14.31,17.49 16.81,17.49 C2.1 18.75,18.64 20.26,17.13 R1.2 25.99,16.35 ; 25.99,16.35 27.01,17.36 R3.2 ; 25.99,16.35 H3.1
AGND: length 65.2
  Top Layer w0.508: v1(7.58,21.94) 7.54,21.9 U1.15 ; R2.1 20.39,13.94 C1.1 20.64,11.52 v1(22.18,11.52) ; v1(22.94,18.76) 22.82,18.64 C2.2 ; H3.2 28.53,8.73 29.42,9.62 C4.1 31.71,9.63 C5.1
  Bottom Layer w0.508: v1(22.18,11.52) 22.23,11.47 28.53,11.47 ; 28.53,11.47 H3.2 ; 28.53,11.47 28.53,17.62 27.39,18.76 v1(22.94,18.76) 22.94,21.05 22.06,21.94 v1(7.58,21.94)
FAULT: length 35.8
  Top Layer w0.381: v1(33.74,13.56) 33.74,17.35 ; 33.74,17.35 R3.1 ; 33.74,17.35 33.74,18.25 31.2,20.79 16.38,20.79 U1.9
  Bottom Layer w0.381: v1(33.74,13.56) 34.88,13.56 36.28,12.16 36.28,4.53 H3.5
VOUT: length 41.9
  Top Layer w0.381: v1(33.87,10.89) 33.87,12.02 C3.2 35.01,12.16 35.26,12.41 35.26,18 31.83,21.43 12.15,21.43 11.35,20.63 U1.12
  Bottom Layer w0.381: H3.4 33.87,4.65 v1(33.87,10.89)
VREF: length 47.6
  Top Layer w0.381: U1.13 10.08,21.01 11.13,22.06 32.34,22.06 36.15,18.25 36.15,10 35.88,9.73 33.84,9.73 C4.2 33.72,8.2 33.23,7.71 31.58,7.71 31.07,7.2 H3.3
$1N949: length 13.1
  Top Layer w0.381: C1.2 18.39,16.22 R1.1 13.29,16.35 12.62,17.02 U1.11

## Copper pours and planes (outline as drawn; the poured copper is in the pictures)
A3V3 on Top Layer: 25.1,6.59 25.11,6.7 25.17,6.83 25.25,6.95 25.37,7.03 25.5,7.08 25.61,7.1 26.37,7.1 26.48,7.08 26.62,7.03 26.73,6.95 26.82,6.83 26.87,6.7 26.88,6.59 26.88,0.06 26.87,-0.05 26.82,-0.19 26.73,-0.3 26.62,-0.39 26.48,-0.44 26.37,-0.45 25.61,-0.45 25.5,-0.44 25.37,-0.39 25.25,-0.3 25.17,-0.19 25.11,-0.05 25.1,0.06
A3V3 on Top Layer: 25.1,6.59 25.11,6.7 25.17,6.83 25.25,6.95 25.37,7.03 25.5,7.08 25.61,7.1 26.37,7.1 26.48,7.08 26.62,7.03 26.73,6.95 26.82,6.83 26.87,6.7 26.88,6.59 26.88,0.06 26.87,-0.05 26.82,-0.19 26.73,-0.3 26.62,-0.39 26.48,-0.44 26.37,-0.45 25.61,-0.45 25.5,-0.44 25.37,-0.39 25.25,-0.3 25.17,-0.19 25.11,-0.05 25.1,0.06
A3V3 on Bottom Layer: 25.1,6.59 25.11,6.7 25.17,6.83 25.25,6.95 25.37,7.03 25.5,7.08 25.61,7.1 26.37,7.1 26.48,7.08 26.62,7.03 26.73,6.95 26.82,6.83 26.87,6.7 26.88,6.59 26.88,0.06 26.87,-0.05 26.82,-0.19 26.73,-0.3 26.62,-0.39 26.48,-0.44 26.37,-0.45 25.61,-0.45 25.5,-0.44 25.37,-0.39 25.25,-0.3 25.17,-0.19 25.11,-0.05 25.1,0.06
AGND on Top Layer: 27.64,6.59 27.65,6.7 27.71,6.83 27.79,6.95 27.91,7.03 28.04,7.08 28.15,7.1 28.91,7.1 29.02,7.08 29.16,7.03 29.27,6.95 29.36,6.83 29.41,6.7 29.42,6.59 29.42,0.06 29.41,-0.05 29.36,-0.19 29.27,-0.3 29.16,-0.39 29.02,-0.44 28.91,-0.45 28.15,-0.45 28.04,-0.44 27.91,-0.39 27.79,-0.3 27.71,-0.19 27.65,-0.05 27.64,0.06
AGND on Bottom Layer: 27.64,6.59 27.65,6.7 27.71,6.83 27.79,6.95 27.91,7.03 28.04,7.08 28.15,7.1 28.91,7.1 29.02,7.08 29.16,7.03 29.27,6.95 29.36,6.83 29.41,6.7 29.42,6.59 29.42,0.06 29.41,-0.05 29.36,-0.19 29.27,-0.3 29.16,-0.39 29.02,-0.44 28.91,-0.45 28.15,-0.45 28.04,-0.44 27.91,-0.39 27.79,-0.3 27.71,-0.19 27.65,-0.05 27.64,0.06
FAULT on Top Layer: 35.26,6.59 35.27,6.7 35.33,6.83 35.41,6.95 35.53,7.03 35.66,7.08 35.77,7.1 36.53,7.1 36.64,7.08 36.78,7.03 36.89,6.95 36.98,6.83 37.03,6.7 37.04,6.59 37.04,0.06 37.03,-0.05 36.98,-0.19 36.89,-0.3 36.78,-0.39 36.64,-0.44 36.53,-0.45 35.77,-0.45 35.66,-0.44 35.53,-0.39 35.41,-0.3 35.33,-0.19 35.27,-0.05 35.26,0.06
FAULT on Bottom Layer: 35.26,6.59 35.27,6.7 35.33,6.83 35.41,6.95 35.53,7.03 35.66,7.08 35.77,7.1 36.53,7.1 36.64,7.08 36.78,7.03 36.89,6.95 36.98,6.83 37.03,6.7 37.04,6.59 37.04,0.06 37.03,-0.05 36.98,-0.19 36.89,-0.3 36.78,-0.39 36.64,-0.44 36.53,-0.45 35.77,-0.45 35.66,-0.44 35.53,-0.39 35.41,-0.3 35.33,-0.19 35.27,-0.05 35.26,0.06
IP+ on Top Layer: 2.46,6.57 2.46,10.47 3.39,11.4 10.12,11.4 10.37,11.14 10.37,8.73 10.12,8.47 9.1,8.47 8.72,8.09 8.72,5.94 8.47,5.68 3.39,5.68 2.5,6.57
IP+ on Top Layer: 1.19,7.36 1.2,7.47 1.25,7.6 1.34,7.72 1.46,7.81 1.59,7.86 1.7,7.87 8.3,7.87 8.41,7.86 8.55,7.81 8.66,7.72 8.75,7.6 8.8,7.47 8.81,7.36 8.81,0.7 8.8,0.59 8.75,0.46 8.66,0.34 8.55,0.25 8.41,0.2 8.3,0.19 1.7,0.19 1.59,0.2 1.46,0.25 1.34,0.34 1.25,0.46 1.2,0.59 1.19,0.7
IP+ on Bottom Layer: 1.19,7.36 1.2,7.47 1.25,7.6 1.34,7.72 1.46,7.81 1.59,7.86 1.7,7.87 8.3,7.87 8.41,7.86 8.55,7.81 8.66,7.72 8.75,7.6 8.8,7.47 8.81,7.36 8.81,0.7 8.8,0.59 8.75,0.46 8.66,0.34 8.55,0.25 8.41,0.2 8.3,0.19 1.7,0.19 1.59,0.2 1.46,0.25 1.34,0.34 1.25,0.46 1.2,0.59 1.19,0.7
IP+ on Bottom Layer: 2.46,6.57 2.46,10.47 3.39,11.4 10.12,11.4 10.37,11.14 10.37,8.73 10.12,8.47 9.1,8.47 8.72,8.09 8.72,5.94 8.47,5.68 3.39,5.68 2.5,6.57
IP+ on Bottom Layer: 1.19,7.36 1.2,7.47 1.25,7.6 1.34,7.72 1.46,7.81 1.59,7.86 1.7,7.87 8.3,7.87 8.41,7.86 8.55,7.81 8.66,7.72 8.75,7.6 8.8,7.47 8.81,7.36 8.81,0.7 8.8,0.59 8.75,0.46 8.66,0.34 8.55,0.25 8.41,0.2 8.3,0.19 1.7,0.19 1.59,0.2 1.46,0.25 1.34,0.34 1.25,0.46 1.2,0.59 1.19,0.7
IP+ on Bottom Layer: 1.19,7.36 1.2,7.47 1.25,7.6 1.34,7.72 1.46,7.81 1.59,7.86 1.7,7.87 8.3,7.87 8.41,7.86 8.55,7.81 8.66,7.72 8.75,7.6 8.8,7.47 8.81,7.36 8.81,0.7 8.8,0.59 8.75,0.46 8.66,0.34 8.55,0.25 8.41,0.2 8.3,0.19 1.7,0.19 1.59,0.2 1.46,0.25 1.34,0.34 1.25,0.46 1.2,0.59 1.19,0.7
IP- on Top Layer: 12.62,7.36 12.63,7.47 12.68,7.6 12.77,7.72 12.89,7.81 13.02,7.86 13.13,7.87 19.73,7.87 19.84,7.86 19.98,7.81 20.09,7.72 20.18,7.6 20.23,7.47 20.24,7.36 20.24,0.7 20.23,0.59 20.18,0.46 20.09,0.34 19.98,0.25 19.84,0.2 19.73,0.19 13.13,0.19 13.02,0.2 12.89,0.25 12.77,0.34 12.68,0.46 12.63,0.59 12.62,0.7
IP- on Top Layer: 12.62,5.75 12.62,8 12.02,8.6 11.39,8.6 11.01,8.98 11.01,11.14 11.26,11.4 15.58,11.4 16.72,10.25 19.52,10.25 20.02,9.75 20.02,5.9 19.73,5.61 19.6,5.75
IP- on Bottom Layer: 12.62,7.36 12.63,7.47 12.68,7.6 12.77,7.72 12.89,7.81 13.02,7.86 13.13,7.87 19.73,7.87 19.84,7.86 19.98,7.81 20.09,7.72 20.18,7.6 20.23,7.47 20.24,7.36 20.24,0.7 20.23,0.59 20.18,0.46 20.09,0.34 19.98,0.25 19.84,0.2 19.73,0.19 13.13,0.19 13.02,0.2 12.89,0.25 12.77,0.34 12.68,0.46 12.63,0.59 12.62,0.7
IP- on Bottom Layer: 12.62,5.74 12.62,8 12.02,8.6 11.39,8.6 11.01,8.98 11.01,11.14 11.26,11.39 15.58,11.39 16.72,10.25 19.52,10.25 20.02,9.74 20.02,5.9 19.73,5.61 19.6,5.74
VOUT on Top Layer: 32.72,6.59 32.73,6.7 32.79,6.83 32.87,6.95 32.99,7.03 33.12,7.08 33.23,7.1 33.99,7.1 34.1,7.08 34.24,7.03 34.35,6.95 34.44,6.83 34.49,6.7 34.5,6.59 34.5,0.06 34.49,-0.05 34.44,-0.19 34.35,-0.3 34.24,-0.39 34.1,-0.44 33.99,-0.45 33.23,-0.45 33.12,-0.44 32.99,-0.39 32.87,-0.3 32.79,-0.19 32.73,-0.05 32.72,0.06
VOUT on Bottom Layer: 32.72,6.59 32.73,6.7 32.79,6.83 32.87,6.95 32.99,7.03 33.12,7.08 33.23,7.1 33.99,7.1 34.1,7.08 34.24,7.03 34.35,6.95 34.44,6.83 34.49,6.7 34.5,6.59 34.5,0.06 34.49,-0.05 34.44,-0.19 34.35,-0.3 34.24,-0.39 34.1,-0.44 33.99,-0.45 33.23,-0.45 33.12,-0.44 32.99,-0.39 32.87,-0.3 32.79,-0.19 32.73,-0.05 32.72,0.06
VREF on Top Layer: 30.18,6.59 30.19,6.7 30.25,6.83 30.33,6.95 30.45,7.03 30.58,7.08 30.69,7.1 31.45,7.1 31.56,7.08 31.7,7.03 31.81,6.95 31.9,6.83 31.95,6.7 31.96,6.59 31.96,0.06 31.95,-0.05 31.9,-0.19 31.81,-0.3 31.7,-0.39 31.56,-0.44 31.45,-0.45 30.69,-0.45 30.58,-0.44 30.45,-0.39 30.33,-0.3 30.25,-0.19 30.19,-0.05 30.18,0.06
VREF on Bottom Layer: 30.18,6.59 30.19,6.7 30.25,6.83 30.33,6.95 30.45,7.03 30.58,7.08 30.69,7.1 31.45,7.1 31.56,7.08 31.7,7.03 31.81,6.95 31.9,6.83 31.95,6.7 31.96,6.59 31.96,0.06 31.95,-0.05 31.9,-0.19 31.81,-0.3 31.7,-0.39 31.56,-0.44 31.45,-0.45 30.69,-0.45 30.58,-0.44 30.45,-0.39 30.33,-0.3 30.25,-0.19 30.19,-0.05 30.18,0.06

## Text on the board
Bottom Silkscreen Layer: A3V3 | AGND | Vref | Vout | Fault | IP+ | IP- | Vref=2.5 / I=(Vout-Vref)*14.993
Top Silkscreen Layer: 惊回首 / 离天三尺三 | Epiphanye | NSM2015 / 霍尔电流

# Board PCB1
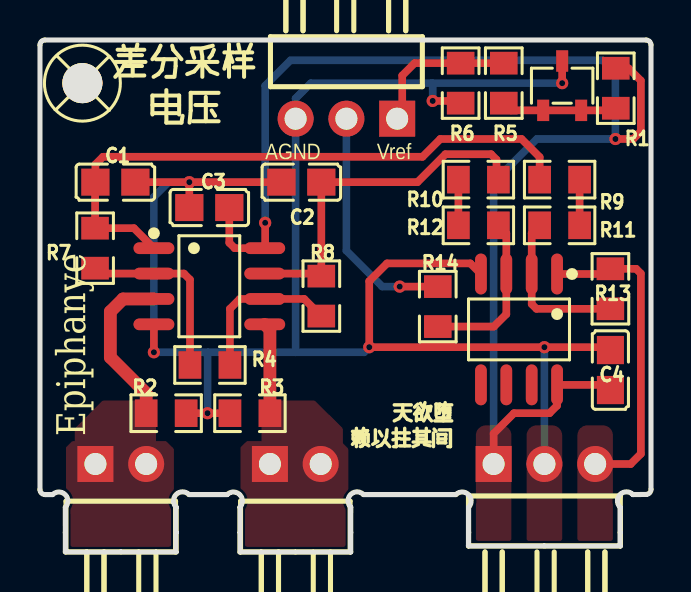
[diagram p5: board, top side]
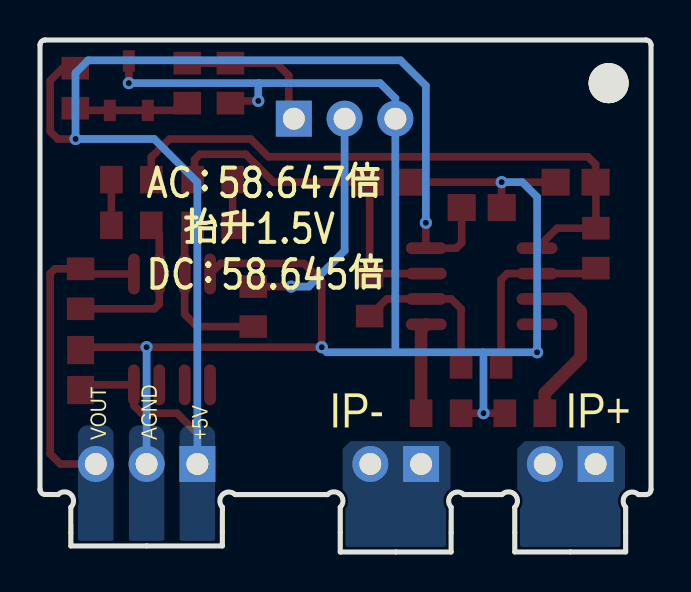
[diagram p6: board, bottom side, seen from below]

Outline 30.57 x 25.61 mm; copper layers: Top Layer, Bottom Layer. Coordinates in mm from the lower left corner of the outline.
Outline path: 0,25.36 arc(0.07,25.54) 0.25,25.61 30.32,25.61 arc(30.5,25.54) 30.57,25.36 30.57,3.13 arc(30.5,2.95) 30.32,2.88 29.66,2.87 arc(29.03,2.87) 29.03,2.24 29.03,0.97 29.03,0.3 21.45,0.3 21.45,0.97 21.45,2.24 arc(21.44,2.87) 20.81,2.87 16.18,2.87 arc(15.55,2.87) 15.55,2.24 15.55,0.97 15.55,0 10,0 10,0.97 10,2.24 arc(10,2.87) 9.36,2.87 7.45,2.87 arc(6.82,2.87) 6.82,2.24 6.82,0.97 6.82,0 1.27,0 1.27,0.97 1.27,2.24 arc(1.27,2.87) 0.63,2.87 0.25,2.87 arc(0.07,2.95) 0,3.13 0,25.36
Stack: Top Layer 0.035mm / Dielectric1 1.51mm FR4 er 4.5 / Bottom Layer 0.035mm

## Design rules (mm)
net AGND: PWR
net +5V: PWR
net VREF: PWR
net +2V5: PWR
spacing copperThickness1oz (default): track to track 0.102, other pairs 0.152 to 0.3
spacing copperThickness2oz: track to track 0.203, other pairs 0.152 to 0.3
spacing Plane_innerPlane: track to track 0.102, other pairs 0.152 to 0.3
spacing Copper_copperRegion: track to track 0.102, other pairs 0.152 to 0.3
track width copperThickness1oz (default): min 0.127, default 0.381, max 2.54
track width copperThickness2oz: min 0.203, default 0.254, max 2.54
track width PWR: min 0.127, default 0.508, max 2.54
differential pair differentialPair (default): width min 0.127, default 0.254, max 2.54; gap min 0.152, default 0.152
pour e139 uses Copper_copperRegion
pour e141 uses Copper_copperRegion
pour e143 uses Copper_copperRegion
pour e145 uses Copper_copperRegion
pour e147 uses Copper_copperRegion
pour e149 uses Copper_copperRegion
pour e151 uses Copper_copperRegion
pour e153 uses Copper_copperRegion
pour e155 uses Copper_copperRegion
pour e157 uses Copper_copperRegion
pour e159 uses Copper_copperRegion
pour e161 uses Copper_copperRegion

## Placement (name value [footprint] x y rotation side)
C1  1nF  [C0805]  3.77 18.5 180 top
C2  1nF  [C0805]  13.08 18.5 180 top
C3  100nF  [C0805]  8.47 17.23 0 top
C4  100nF  [C0805]  28.54 9.1 270 top
H1  PZ254R-11-02P  [HDR-TH_2P-P2.54-H-M-W10.4]  4.04 4.4 0 top
H2  PZ254R-11-02P  [HDR-TH_2P-P2.54-H-M-W10.4]  12.77 4.4 0 top
H3  PZ254R-11-03P  [HDR-TH_3P-P2.54-H-M-W10.4]  15.33 21.68 180 top
H4  PZ254R-11-03P  [HDR-TH_3P-P2.54-H-M-W10.4]  25.24 4.4 0 top
R1  1K  [R0805]  28.81 23.2 90 top
R2  10K  [R0805]  6.31 6.94 180 top
R3  10K  [R0805]  10.5 6.94 180 top
R4  2K  [R0805]  8.5 9.36 180 top
R5  1K  [R0805]  23.2 23.45 270 top
R6  1.5K  [R0805]  21.05 23.45 90 top
R7  1K  [R0805]  2.76 15.2 270 top
R8  1K  [R0805]  14.08 12.8 270 top
R9  100K  [R0805]  26 18.63 180 top
R10  100K  [R0805]  21.93 18.63 0 top
R11  100K  [R0805]  26 16.34 0 top
R12  100K  [R0805]  21.93 16.34 180 top
R13  1K  [R0805]  28.54 13.17 90 top
R14  1K  [R0805]  19.9 12.28 270 top
SCREW1  -  [M2螺丝]  2.12 23.45 0 top
U1  TL431AIDBZR  [SOT-23-3_L2.9-W1.6-P1.90-LS2.8-BR]  26.13 23.33 270 top
U2  SGM8632XS/TR  [SOIC-8_L4.9-W3.9-P1.27-LS6.0-BL]  8.47 13.29 270 top
U3  SGM8632XS/TR  [SOIC-8_L4.9-W3.9-P1.27-LS6.0-BL]  23.97 11.13 180 top

## Footprints (pads in the part's own frame, mm; a bottom-side part is the same pattern mirrored in y, then rotated)
C0805
  rect 1.41x1.35 smd: 1(-1,0) 2(1,0)
HDR-TH_2P-P2.54-H-M-W10.4
  rect 1.8x1.8 hole 1.1: 1(-1.27,0)
  round 1.8 hole 1.1: 2(1.27,0)
HDR-TH_3P-P2.54-H-M-W10.4
  rect 1.8x1.8 hole 1.1: 1(-2.54,0)
  round 1.8 hole 1.1: 2(0,0) 3(2.54,0)
M2螺丝
  round 2 hole 2: 1(0,0)
R0805
  rect 1.133x1.377 smd: 1(-1,0) 2(1,0)
SOIC-8_L4.9-W3.9-P1.27-LS6.0-BL
  oval 0.588x2.045 smd: 1(-1.905,-2.772) 2(-0.635,-2.772) 3(0.635,-2.772) 4(1.905,-2.772) 5(1.905,2.772) 6(0.635,2.772) 7(-0.635,2.772) 8(-1.905,2.772)
SOT-23-3_L2.9-W1.6-P1.90-LS2.8-BR
  rect 1.07x0.6 smd: 1(1.235,-0.95) 2(1.235,0.95) 3(-1.235,0)

## Nets
As in the schematic.

Pads without a net: SCREW1 1; U3 5 6 7

## Via types
v1: diameter 0.61, hole 0.305, Top Layer to Bottom Layer, 10 vias

## Routing (per net, layer and track width the routed paths; a pad name or vN(x,y) marks a point on that pad's centre or on a via; arc(x,y) is an arc through that point)
+2V5: length 5.8
  Top Layer w0.381: R1.1 28.7,22.09 U1.2 U1.1 23.57,22.09 R5.2
+5V: length 69.1
  Top Layer w0.381: C4.2 28.28,8.36 U3.8 25.87,7.32 25.49,6.94 23.71,6.94 22.7,5.93 22.7,4.4 ; v1(11.27,16.47) 11.27,15.22 U2.8 9.74,15.2 9.47,15.47 C3.2 ; R1.2 29.44,24.2 30.06,23.58 30.06,21.04 29.68,20.66 v1(28.79,20.66)
  Bottom Layer w0.381: 22.7,4.4 22.7,18.5 24.86,20.66 v1(28.79,20.66) 28.79,23.96 28.16,24.6 12.54,24.6 11.27,23.33 v1(11.27,16.47)
AGND: length 93.2
  Top Layer w0.381: v1(19.65,22.56) 20.93,22.56 R6.1 ; C1.1 v1(7.47,18.5) ; v1(7.47,18.5) C2.2 ; v1(7.47,18.5) C3.1 ; U2.4 v1(5.7,9.99) ; R3.2 v1(8.38,6.94) R2.1 ; U3.4 21.53,14.44 17.36,14.44 16.47,13.55 v1(16.47,10.25) v1(25.24,10.25) 28.4,10.25 C4.1 ; U1.3 v1(26.13,23.45)
  Bottom Layer w0.381: 19.63,23.45 v1(26.13,23.45) ; 19.63,23.45 19.65,23.43 v1(19.65,22.56) ; 19.63,23.45 13.55,23.45 12.79,22.69 H3.3 12.79,9.99 ; v1(8.38,6.94) 8.38,9.96 8.41,9.99 ; 8.41,9.99 12.79,9.99 ; 8.41,9.99 v1(5.7,9.99) 5.7,17.76 6.44,18.5 v1(7.47,18.5) ; 12.79,9.99 16.22,9.99 v1(16.47,10.25) ; H4.2 v1(25.24,10.25)
IP+: length 8.3
  Top Layer w0.635: 5.7,12.66 4.15,12.66 3.52,12.02 3.52,9.74 5.31,7.94 R2.2
IP-: length 4.6
  Top Layer w0.635: R3.1 11.5,11.13 U2.5
VOUT: length 15.9
  Top Layer w0.381: H4.3 29.55,4.4 30.06,4.91 30.06,13.93 29.82,14.17 R13.2 28.28,13.91 U3.1
VREF: length 7.6
  Top Layer w0.381: R5.1 R6.2 18.74,24.45 18.12,23.83 18.12,21.55
$1N1802: length 7.9
  Top Layer w0.381: R4.1 9.5,12.17 10,12.66 13.22,12.66 R8.2
$1N1807: length 9.3
  Top Layer w0.381: R4.2 7.5,13.63 7.2,13.93 U2.2 3.03,13.93 R7.2
$1N1968: length 8.1
  Top Layer w0.381: R13.1 24.84,12.17 24.6,12.4 U3.2 24.6,15.94 R11.1
$1N1973: length 8.3
  Top Layer w0.381: R14.2 22.71,11.28 23.33,11.9 U3.3 23.33,15.94 R12.1
$1N3429: length 12
  Top Layer w0.381: R14.1 v1(18,13.28)
  Bottom Layer w0.381: v1(18,13.28) 17.12,13.28 15.33,15.07 15.33,21.42 15.58,21.68
$1N4502: length 2.3
  Top Layer w0.381: R11.2 R9.1
$1N4511: length 30.8
  Top Layer w0.381: R9.2 25,19.75 24.09,20.66 20.03,20.66 19.14,19.77 3.15,19.77 2.77,19.39 C1.2 2.76,18.48 R7.1 4.7,16.2 U2.1
$1N4538: length 2.3
  Top Layer w0.381: R12.2 R10.1
$1N4547: length 18.1
  Top Layer w0.381: U2.7 13.95,13.93 R8.1 C2.1 18.89,18.5 20.28,19.9 22.57,19.9 22.84,19.63 22.84,18.72 R10.2

## Copper pours and planes (outline as drawn; the poured copper is in the pictures)
+5V on Top Layer: 21.81,5.83 21.82,5.94 21.87,6.07 21.96,6.19 22.07,6.28 22.21,6.33 22.31,6.34 23.08,6.34 23.18,6.33 23.32,6.28 23.44,6.19 23.52,6.07 23.57,5.94 23.59,5.83 23.59,0.06 23.57,-0.05 23.52,-0.18 23.44,-0.3 23.32,-0.39 23.18,-0.44 23.08,-0.45 22.31,-0.45 22.21,-0.44 22.07,-0.39 21.96,-0.3 21.87,-0.18 21.82,-0.05 21.81,0.06
+5V on Bottom Layer: 21.81,5.83 21.82,5.94 21.87,6.07 21.96,6.19 22.07,6.28 22.21,6.33 22.31,6.34 23.08,6.34 23.18,6.33 23.32,6.28 23.44,6.19 23.52,6.07 23.57,5.94 23.59,5.83 23.59,0.06 23.57,-0.05 23.52,-0.18 23.44,-0.3 23.32,-0.39 23.18,-0.44 23.08,-0.45 22.31,-0.45 22.21,-0.44 22.07,-0.39 21.96,-0.3 21.87,-0.18 21.82,-0.05 21.81,0.06
AGND on Top Layer: 24.35,5.83 24.36,5.94 24.41,6.07 24.5,6.19 24.61,6.28 24.75,6.33 24.85,6.34 25.62,6.34 25.72,6.33 25.86,6.28 25.98,6.19 26.06,6.07 26.11,5.94 26.12,5.83 26.12,0.06 26.11,-0.05 26.06,-0.18 25.98,-0.3 25.86,-0.39 25.72,-0.44 25.62,-0.45 24.85,-0.45 24.75,-0.44 24.61,-0.39 24.5,-0.3 24.41,-0.18 24.36,-0.05 24.35,0.06
AGND on Bottom Layer: 24.35,5.83 24.36,5.94 24.41,6.07 24.5,6.19 24.61,6.28 24.75,6.33 24.85,6.34 25.62,6.34 25.72,6.33 25.86,6.28 25.98,6.19 26.06,6.07 26.11,5.94 26.12,5.83 26.12,0.06 26.11,-0.05 26.06,-0.18 25.98,-0.3 25.86,-0.39 25.72,-0.44 25.62,-0.45 24.85,-0.45 24.75,-0.44 24.61,-0.39 24.5,-0.3 24.41,-0.18 24.36,-0.05 24.35,0.06
IP+ on Top Layer: 1.74,4.91 1.74,6.18 3.14,7.58 5.55,7.58 5.81,7.32 5.81,5.29 5.43,4.91
IP+ on Top Layer: 1.3,-0.62 1.3,5.24 1.61,5.55 6.31,5.55 6.69,5.17 6.69,-0.8 6.51,-0.62
IP+ on Bottom Layer: 1.3,-0.62 1.3,5.24 1.61,5.55 6.31,5.55 6.69,5.17 6.69,-0.8 6.51,-0.62
IP- on Top Layer: 10.03,-0.62 10.03,5.24 10.35,5.55 15.04,5.55 15.43,5.17 15.43,-0.8 15.24,-0.62
IP- on Top Layer: 15.15,4.91 15.15,6.18 13.75,7.58 11.34,7.58 11.09,7.32 11.09,5.29 11.46,4.91
IP- on Bottom Layer: 10.03,-0.62 10.03,5.24 10.35,5.55 15.04,5.55 15.43,5.17 15.43,-0.8 15.24,-0.62
VOUT on Top Layer: 26.89,5.83 26.9,5.94 26.95,6.07 27.04,6.19 27.15,6.28 27.29,6.33 27.4,6.34 28.16,6.34 28.26,6.33 28.4,6.28 28.52,6.19 28.6,6.07 28.65,5.94 28.66,5.83 28.66,0.06 28.65,-0.05 28.6,-0.18 28.52,-0.3 28.4,-0.39 28.26,-0.44 28.16,-0.45 27.4,-0.45 27.29,-0.44 27.15,-0.39 27.04,-0.3 26.95,-0.18 26.9,-0.05 26.89,0.06
VOUT on Bottom Layer: 26.89,5.83 26.9,5.94 26.95,6.07 27.04,6.19 27.15,6.28 27.29,6.33 27.4,6.34 28.16,6.34 28.26,6.33 28.4,6.28 28.52,6.19 28.6,6.07 28.65,5.94 28.66,5.83 28.66,0.06 28.65,-0.05 28.6,-0.18 28.52,-0.3 28.4,-0.39 28.26,-0.44 28.16,-0.45 27.4,-0.45 27.29,-0.44 27.15,-0.39 27.04,-0.3 26.95,-0.18 26.9,-0.05 26.89,0.06

## Text on the board
Bottom Silkscreen Layer: +5V | AGND | VOUT | IP+ | IP- | AC：58.647倍 / 抬升1.5V / DC：58.645倍
Top Silkscreen Layer: 天欲堕 / 赖以拄其间 | AGND | Vref | Epiphanye | 差分采样 / 电压

# Board PCB4
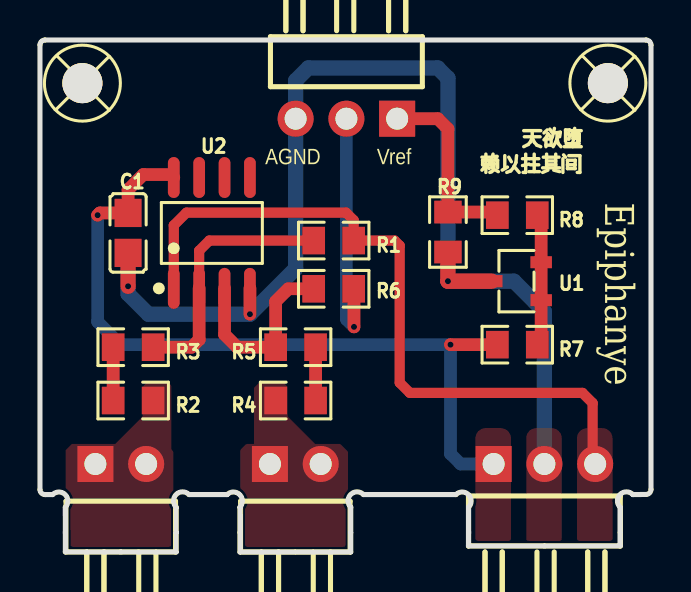
[diagram p7: board, top side]
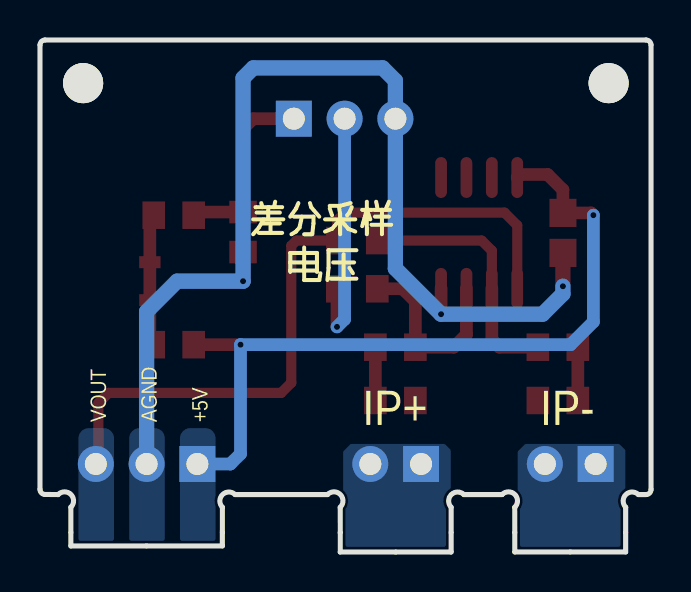
[diagram p8: board, bottom side, seen from below]

Outline 30.57 x 25.61 mm; copper layers: Top Layer, Bottom Layer. Coordinates in mm from the lower left corner of the outline.
Outline path: 0,25.36 arc(0.07,25.54) 0.25,25.61 30.32,25.61 arc(30.5,25.54) 30.57,25.36 30.57,3.13 arc(30.5,2.95) 30.32,2.88 29.66,2.87 arc(29.03,2.87) 29.03,2.24 29.03,0.97 29.03,0.3 21.45,0.3 21.45,0.97 21.45,2.24 arc(21.44,2.87) 20.81,2.87 16.18,2.87 arc(15.55,2.87) 15.55,2.24 15.55,0.97 15.55,0 10,0 10,0.97 10,2.24 arc(10,2.87) 9.36,2.87 7.45,2.87 arc(6.82,2.87) 6.82,2.24 6.82,0.97 6.82,0 1.27,0 1.27,0.97 1.27,2.24 arc(1.27,2.87) 0.63,2.87 0.25,2.87 arc(0.07,2.95) 0,3.13 0,25.36
Stack: Top Layer 0.035mm / Dielectric1 1.51mm FR4 er 4.5 / Bottom Layer 0.035mm

## Design rules (mm)
spacing copperThickness1oz (default): track to track 0.102, other pairs 0.152 to 0.3
spacing copperThickness2oz: track to track 0.203, other pairs 0.152 to 0.3
spacing Plane_innerPlane: track to track 0.102, other pairs 0.152 to 0.3
spacing Copper_copperRegion: track to track 0.102, other pairs 0.152 to 0.3
track width copperThickness1oz (default): min 0.127, default 0.254, max 2.54
track width copperThickness2oz: min 0.203, default 0.254, max 2.54
differential pair differentialPair (default): width min 0.127, default 0.254, max 2.54; gap min 0.152, default 0.152
pour e102 uses Copper_copperRegion
pour e104 uses Copper_copperRegion
pour e106 uses Copper_copperRegion
pour e108 uses Copper_copperRegion
pour e110 uses Copper_copperRegion
pour e112 uses Copper_copperRegion
pour e114 uses Copper_copperRegion
pour e116 uses Copper_copperRegion
pour e118 uses Copper_copperRegion
pour e120 uses Copper_copperRegion
pour e122 uses Copper_copperRegion
pour e124 uses Copper_copperRegion

## Placement (name value [footprint] x y rotation side)
C1  100nF  [C0805]  4.41 15.96 90 top
H1  PZ254R-11-02P  [HDR-TH_2P-P2.54-H-M-W10.4]  4.04 4.4 0 top
H2  PZ254R-11-03P  [HDR-TH_3P-P2.54-H-M-W10.4]  25.24 4.4 0 top
H3  PZ254R-11-02P  [HDR-TH_2P-P2.54-H-M-W10.4]  12.78 4.4 0 top
H4  PZ254R-11-03P  [HDR-TH_3P-P2.54-H-M-W10.4]  15.33 21.68 180 top
R1  1K  [R0805]  14.7 15.58 0 top
R2  100K  [R0805]  4.66 7.58 0 top
R3  100K  [R0805]  4.66 10.25 180 top
R4  100K  [R0805]  12.79 7.58 180 top
R5  100K  [R0805]  12.79 10.25 0 top
R6  1K  [R0805]  14.7 13.17 180 top
R7  1K  [R0805]  23.88 10.37 180 top
R8  1K  [R0805]  23.88 16.85 0 top
R9  1.5K  [R0805]  20.41 16.01 90 top
SCREW1  -  [M2螺丝]  2.12 23.45 0 top
SCREW2  -  [M2螺丝]  28.41 23.45 0 top
U1  TL431AIDBZR  [SOT-23-3_L2.9-W1.6-P1.90-LS2.8-BR]  23.84 13.55 0 top
U2  SGM8632XS/TR  [SOIC-8_L4.9-W3.9-P1.27-LS6.0-BL]  8.6 15.96 0 top

## Footprints (pads in the part's own frame, mm; a bottom-side part is the same pattern mirrored in y, then rotated)
C0805
  rect 1.41x1.35 smd: 1(-1,0) 2(1,0)
HDR-TH_2P-P2.54-H-M-W10.4
  rect 1.8x1.8 hole 1.1: 1(-1.27,0)
  round 1.8 hole 1.1: 2(1.27,0)
HDR-TH_3P-P2.54-H-M-W10.4
  rect 1.8x1.8 hole 1.1: 1(-2.54,0)
  round 1.8 hole 1.1: 2(0,0) 3(2.54,0)
M2螺丝
  round 2 hole 2: 1(0,0)
R0805
  rect 1.133x1.377 smd: 1(-1,0) 2(1,0)
SOIC-8_L4.9-W3.9-P1.27-LS6.0-BL
  oval 0.588x2.045 smd: 1(-1.905,-2.772) 2(-0.635,-2.772) 3(0.635,-2.772) 4(1.905,-2.772) 5(1.905,2.772) 6(0.635,2.772) 7(-0.635,2.772) 8(-1.905,2.772)
SOT-23-3_L2.9-W1.6-P1.90-LS2.8-BR
  rect 1.07x0.6 smd: 1(1.235,-0.95) 2(1.235,0.95) 3(-1.235,0)

## Nets
As in the schematic.

Pads without a net: SCREW1 1; SCREW2 1; U2 5 6 7

## Via types
v1: diameter 0.61, hole 0.305, Top Layer to Bottom Layer, 6 vias

## Routing (per net, layer and track width the routed paths; a pad name or vN(x,y) marks a point on that pad's centre or on a via; arc(x,y) is an arc through that point)
+2V5: length 6.6
  Top Layer w0.635: R8.2 25.07,16.66 U1.2 U1.1 25.07,10.57 R7.1
+5V: length 39
  Top Layer w0.635: v1(2.88,16.85) 3,16.96 C1.2 4.41,18.12 5.17,18.88 6.55,18.88 U2.8 ; R7.2 v1(20.54,10.37)
  Bottom Layer w0.635: 22.7,4.4 21.05,4.4 20.54,4.91 v1(20.54,10.37) 4.03,10.37 2.88,11.52 v1(2.88,16.85)
AGND: length 57.5
  Top Layer w0.635: U2.4 v1(10.5,11.9)
  Top Layer w0.762: R9.1 v1(20.41,13.55) U1.3 ; v1(4.41,13.29) C1.1
  Bottom Layer w0.762: v1(4.41,13.29) 4.41,12.91 5.42,11.9 v1(10.5,11.9) 12.79,14.18 H4.3 12.79,23.58 13.43,24.22 19.9,24.22 20.41,23.71 v1(20.41,13.55) 23.71,13.55 25.24,12.02 H2.2
VOUT: length 35.6
  Top Layer w0.508: U2.1 6.69,16.34 7.33,16.98 15.31,16.98 15.7,16.6 15.7,15.96 ; H2.3 27.65,4.53 27.65,7.45 27.14,7.96 18.51,7.96 18,8.47 18,15.33 17.74,15.58 R1.2
VREF: length 9.4
  Top Layer w0.635: R8.1 22.72,17.01 R9.2 20.41,21.17 19.9,21.68 H4.1
$1N698: length 9.8
  Top Layer w0.635: 13.7,13.42 R6.2 12.43,13.17 11.79,12.53 R5.1 9.87,10.25 9.23,10.88 U2.3
$1N699: length 2.7
  Top Layer w0.635: R5.2 R4.1
$1N700: length 2.7
  Top Layer w0.635: R2.1 R3.2
$1N701: length 12.8
  Top Layer w0.508: R1.1 8.47,15.58 7.96,15.07 7.96,13.19
  Top Layer w0.635: R3.1 7.58,10.25 7.96,10.63 7.96,13.19
$1N710: length 12.5
  Top Layer w0.635: R6.1 15.71,13.15 v1(15.71,11.26)
  Bottom Layer w0.635: H4.2 15.33,11.64 v1(15.71,11.26)

## Copper pours and planes (outline as drawn; the poured copper is in the pictures)
+5V on Top Layer: 21.79,5.69 21.8,5.8 21.85,5.93 21.94,6.05 22.05,6.13 22.19,6.18 22.29,6.2 23.06,6.2 23.16,6.18 23.3,6.13 23.42,6.05 23.5,5.93 23.55,5.8 23.56,5.69 23.56,-0.08 23.55,-0.19 23.5,-0.32 23.42,-0.44 23.3,-0.53 23.16,-0.58 23.06,-0.59 22.29,-0.59 22.19,-0.58 22.05,-0.53 21.94,-0.44 21.85,-0.32 21.8,-0.19 21.79,-0.08
+5V on Bottom Layer: 21.79,5.69 21.8,5.8 21.85,5.93 21.94,6.05 22.05,6.13 22.19,6.18 22.29,6.2 23.06,6.2 23.16,6.18 23.3,6.13 23.42,6.05 23.5,5.93 23.55,5.8 23.56,5.69 23.56,-0.08 23.55,-0.19 23.5,-0.32 23.42,-0.44 23.3,-0.53 23.16,-0.58 23.06,-0.59 22.29,-0.59 22.19,-0.58 22.05,-0.53 21.94,-0.44 21.85,-0.32 21.8,-0.19 21.79,-0.08
AGND on Top Layer: 24.33,5.69 24.34,5.8 24.39,5.93 24.48,6.05 24.59,6.13 24.73,6.18 24.84,6.2 25.6,6.2 25.7,6.18 25.84,6.13 25.96,6.05 26.04,5.93 26.09,5.8 26.1,5.69 26.1,-0.08 26.09,-0.19 26.04,-0.32 25.96,-0.44 25.84,-0.53 25.7,-0.58 25.6,-0.59 24.84,-0.59 24.73,-0.58 24.59,-0.53 24.48,-0.44 24.39,-0.32 24.34,-0.19 24.33,-0.08
AGND on Bottom Layer: 24.33,5.69 24.34,5.8 24.39,5.93 24.48,6.05 24.59,6.13 24.73,6.18 24.84,6.2 25.6,6.2 25.7,6.18 25.84,6.13 25.96,6.05 26.04,5.93 26.09,5.8 26.1,5.69 26.1,-0.08 26.09,-0.19 26.04,-0.32 25.96,-0.44 25.84,-0.53 25.7,-0.58 25.6,-0.59 24.84,-0.59 24.73,-0.58 24.59,-0.53 24.48,-0.44 24.39,-0.32 24.34,-0.19 24.33,-0.08
VOUT on Top Layer: 26.87,5.69 26.88,5.8 26.93,5.93 27.02,6.05 27.13,6.13 27.27,6.18 27.38,6.2 28.14,6.2 28.24,6.18 28.38,6.13 28.5,6.05 28.58,5.93 28.63,5.8 28.65,5.69 28.65,-0.08 28.63,-0.19 28.58,-0.32 28.5,-0.44 28.38,-0.53 28.24,-0.58 28.14,-0.59 27.38,-0.59 27.27,-0.58 27.13,-0.53 27.02,-0.44 26.93,-0.32 26.88,-0.19 26.87,-0.08
VOUT on Bottom Layer: 26.87,5.69 26.88,5.8 26.93,5.93 27.02,6.05 27.13,6.13 27.27,6.18 27.38,6.2 28.14,6.2 28.24,6.18 28.38,6.13 28.5,6.05 28.58,5.93 28.63,5.8 28.65,5.69 28.65,-0.08 28.63,-0.19 28.58,-0.32 28.5,-0.44 28.38,-0.53 28.24,-0.58 28.14,-0.59 27.38,-0.59 27.27,-0.58 27.13,-0.53 27.02,-0.44 26.93,-0.32 26.88,-0.19 26.87,-0.08
$1N927 on Top Layer: 1.28,-0.76 1.28,5.09 1.59,5.41 6.29,5.41 6.67,5.02 6.67,-0.94 6.49,-0.76
$1N927 on Top Layer: 3.01,4.66 5.14,6.78 5.14,8.27 5.37,8.5 6.41,8.5 6.57,8.34 6.57,4.78 6.44,4.66
$1N927 on Bottom Layer: 1.28,-0.76 1.28,5.09 1.59,5.41 6.29,5.41 6.67,5.02 6.67,-0.94 6.49,-0.76
$1N934 on Top Layer: 10.02,-0.76 10.02,5.09 10.33,5.41 15.03,5.41 15.41,5.02 15.41,-0.94 15.22,-0.76
$1N934 on Top Layer: 14.52,4.66 12.39,6.78 12.39,8.27 12.16,8.5 10.99,8.5 10.71,8.21 10.71,5.04 11.09,4.66
$1N934 on Bottom Layer: 10.02,-0.76 10.02,5.09 10.33,5.41 15.03,5.41 15.41,5.02 15.41,-0.94 15.22,-0.76

## Text on the board
Bottom Silkscreen Layer: +5V | AGND | VOUT | IP- | IP+ | 差分采样 / 电压
Top Silkscreen Layer: 天欲堕 / 赖以拄其间 | AGND | Vref | Epiphanye
